# EAGLE schematic Encoder PCB - REV 17.2 (EAGLE 7.5.0)

## Sheet 1 of 11
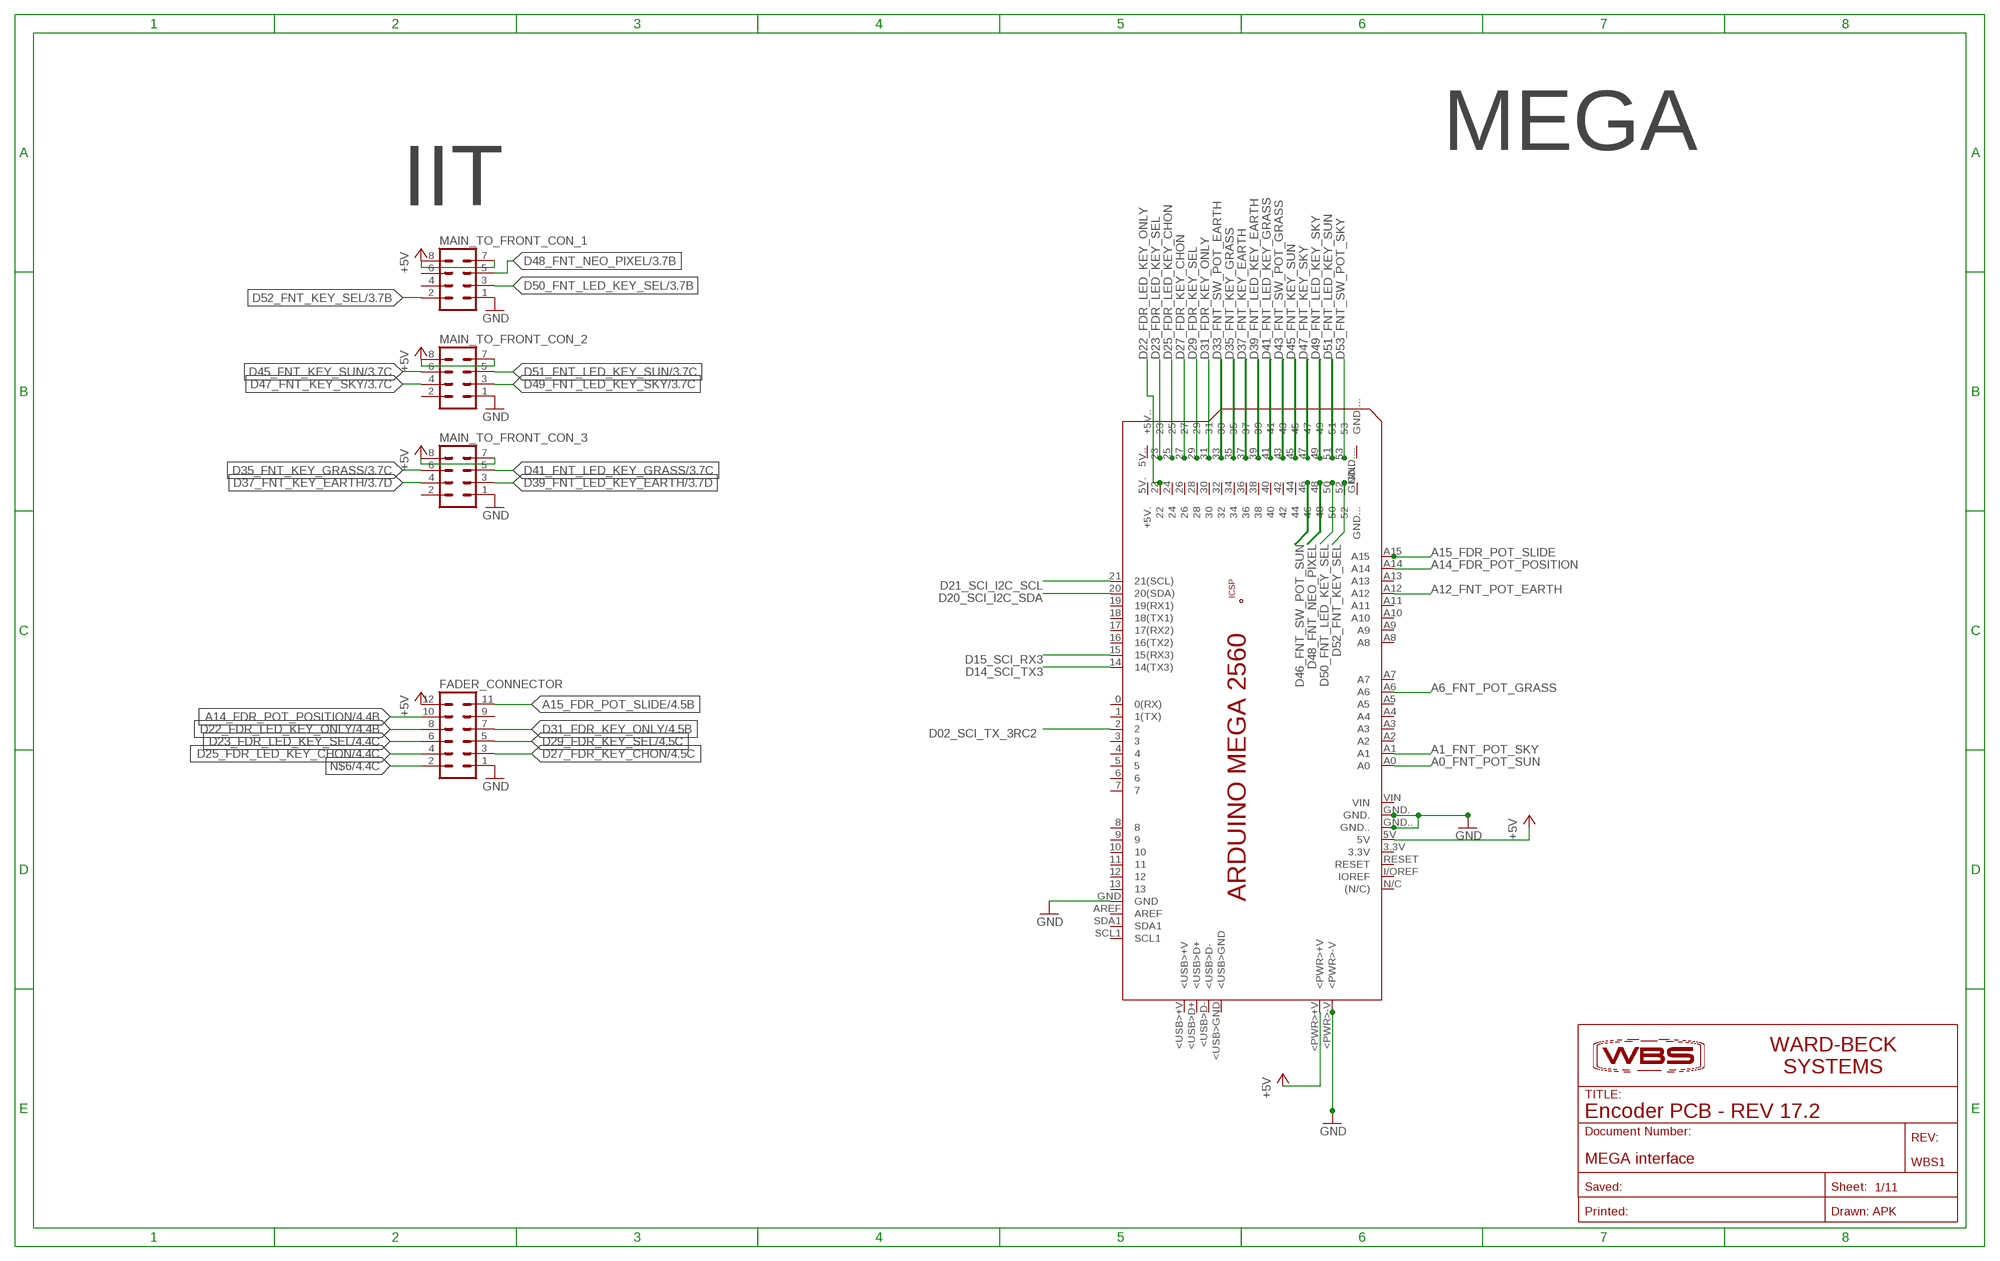
[diagram p0: schematic, sheet 1]

### Parts
FADER_CONNECTOR  MA06-2  [MA06-2]
MAIN_TO_FRONT_CON_1  MA04-2  [MA04-2]
MAIN_TO_FRONT_CON_2  MA04-2  [MA04-2]
MAIN_TO_FRONT_CON_3  MA04-2  [MA04-2]
PCB1  ARDUINO_MEGA2560  [ARDUINO_MEGA2560]
WBS1  MEGA interface  WBS-DOCUMENT_INFO_FRAME  [WBS-FRAME_PCB]

### Nets
+5V: FADER_CONNECTOR.12 MAIN_TO_FRONT_CON_1.7 MAIN_TO_FRONT_CON_1.8 MAIN_TO_FRONT_CON_2.7 MAIN_TO_FRONT_CON_2.8 MAIN_TO_FRONT_CON_3.7 MAIN_TO_FRONT_CON_3.8 PCB1.5V PCB1.<PWR>+V ; also sheet 2,3,4,5,6
A0_FNT_POT_SUN: PCB1.A0 ; also sheet 2
A1_FNT_POT_SKY: PCB1.A1 ; also sheet 2
A6_FNT_POT_GRASS: PCB1.A6 ; also sheet 2
A12_FNT_POT_EARTH: PCB1.A12 ; also sheet 2
A14_FDR_POT_POSITION: FADER_CONNECTOR.10 PCB1.A14 ; also sheet 4
A15_FDR_POT_SLIDE: FADER_CONNECTOR.11 PCB1.A15 ; also sheet 4
D02_SCI_TX_3RC2: PCB1.2 ; also sheet 5
D14_SCI_TX3: PCB1.14(14(TX3)) ; also sheet 5
D15_SCI_RX3: PCB1.15(15(RX3)) ; also sheet 5
D20_SCI_I2C_SDA: PCB1.20(20(SDA)) ; also sheet 6
D21_SCI_I2C_SCL: PCB1.21(21(SCL)) ; also sheet 6
D22_FDR_LED_KEY_ONLY: FADER_CONNECTOR.8 PCB1.22 ; also sheet 4
D23_FDR_LED_KEY_SEL: FADER_CONNECTOR.6 PCB1.23 ; also sheet 4
D25_FDR_LED_KEY_CHON: FADER_CONNECTOR.4 PCB1.25 ; also sheet 4
D27_FDR_KEY_CHON: FADER_CONNECTOR.3 PCB1.27 ; also sheet 4
D29_FDR_KEY_SEL: FADER_CONNECTOR.5 PCB1.29 ; also sheet 4
D31_FDR_KEY_ONLY: FADER_CONNECTOR.7 PCB1.31 ; also sheet 4
D33_FNT_SW_POT_EARTH: PCB1.33 ; also sheet 2
D35_FNT_KEY_GRASS: MAIN_TO_FRONT_CON_3.6 PCB1.35 ; also sheet 3
D37_FNT_KEY_EARTH: MAIN_TO_FRONT_CON_3.4 PCB1.37 ; also sheet 3
D39_FNT_LED_KEY_EARTH: MAIN_TO_FRONT_CON_3.3 PCB1.39 ; also sheet 3
D41_FNT_LED_KEY_GRASS: MAIN_TO_FRONT_CON_3.5 PCB1.41 ; also sheet 3
D43_FNT_SW_POT_GRASS: PCB1.43 ; also sheet 2
D45_FNT_KEY_SUN: MAIN_TO_FRONT_CON_2.6 PCB1.45 ; also sheet 3
D46_FNT_SW_POT_SUN: PCB1.46 ; also sheet 2
D47_FNT_KEY_SKY: MAIN_TO_FRONT_CON_2.4 PCB1.47 ; also sheet 3
D48_FNT_NEO_PIXEL: MAIN_TO_FRONT_CON_1.5 PCB1.48 ; also sheet 3
D49_FNT_LED_KEY_SKY: MAIN_TO_FRONT_CON_2.3 PCB1.49 ; also sheet 3
D50_FNT_LED_KEY_SEL: MAIN_TO_FRONT_CON_1.3 PCB1.50 ; also sheet 3
D51_FNT_LED_KEY_SUN: MAIN_TO_FRONT_CON_2.5 PCB1.51 ; also sheet 3
D52_FNT_KEY_SEL: MAIN_TO_FRONT_CON_1.2 PCB1.52 ; also sheet 3
D53_FNT_SW_POT_SKY: PCB1.53 ; also sheet 2
GND: FADER_CONNECTOR.1 MAIN_TO_FRONT_CON_1.1 MAIN_TO_FRONT_CON_2.1 MAIN_TO_FRONT_CON_3.1 PCB1.<PWR>-V PCB1.GND PCB1.GND. PCB1.GND.. ; also sheet 2,3,4,5,6,7,11
N$6: FADER_CONNECTOR.2 ; also sheet 4
Unconnected: FADER_CONNECTOR.9 MAIN_TO_FRONT_CON_1.4 MAIN_TO_FRONT_CON_1.6 MAIN_TO_FRONT_CON_2.2 MAIN_TO_FRONT_CON_3.2 PCB1.0(0(RX)) PCB1.1(1(TX)) PCB1.3 PCB1.3.3V PCB1.4 PCB1.5 PCB1.5V.(+5V.) PCB1.5V..(+5V..) PCB1.6 PCB1.7 PCB1.8 PCB1.9 PCB1.10 PCB1.11 PCB1.12 PCB1.13 PCB1.16(16(TX2)) PCB1.17(17(RX2)) PCB1.18(18(TX1)) PCB1.19(19(RX1)) PCB1.24 PCB1.26 PCB1.28 PCB1.30 PCB1.32 PCB1.34 PCB1.36 PCB1.38 PCB1.40 PCB1.42 PCB1.44 PCB1.+5V_ PCB1.<USB>+V PCB1.<USB>D+ PCB1.<USB>D- PCB1.<USB>GND PCB1.A2 PCB1.A3 PCB1.A4 PCB1.A5 PCB1.A7 PCB1.A8 PCB1.A9 PCB1.A10 PCB1.A11 PCB1.A13 PCB1.AREF PCB1.GND... PCB1.GND.... PCB1.GND__ PCB1.I/OREF(IOREF) PCB1.MISO PCB1.MOSI PCB1.N/C((N/C)) PCB1.RESET PCB1.RESET. PCB1.SCK PCB1.SCL1 PCB1.SDA1 PCB1.VIN

### Notes on the sheet
- MEGA
- IIT

## Sheet 2 of 11
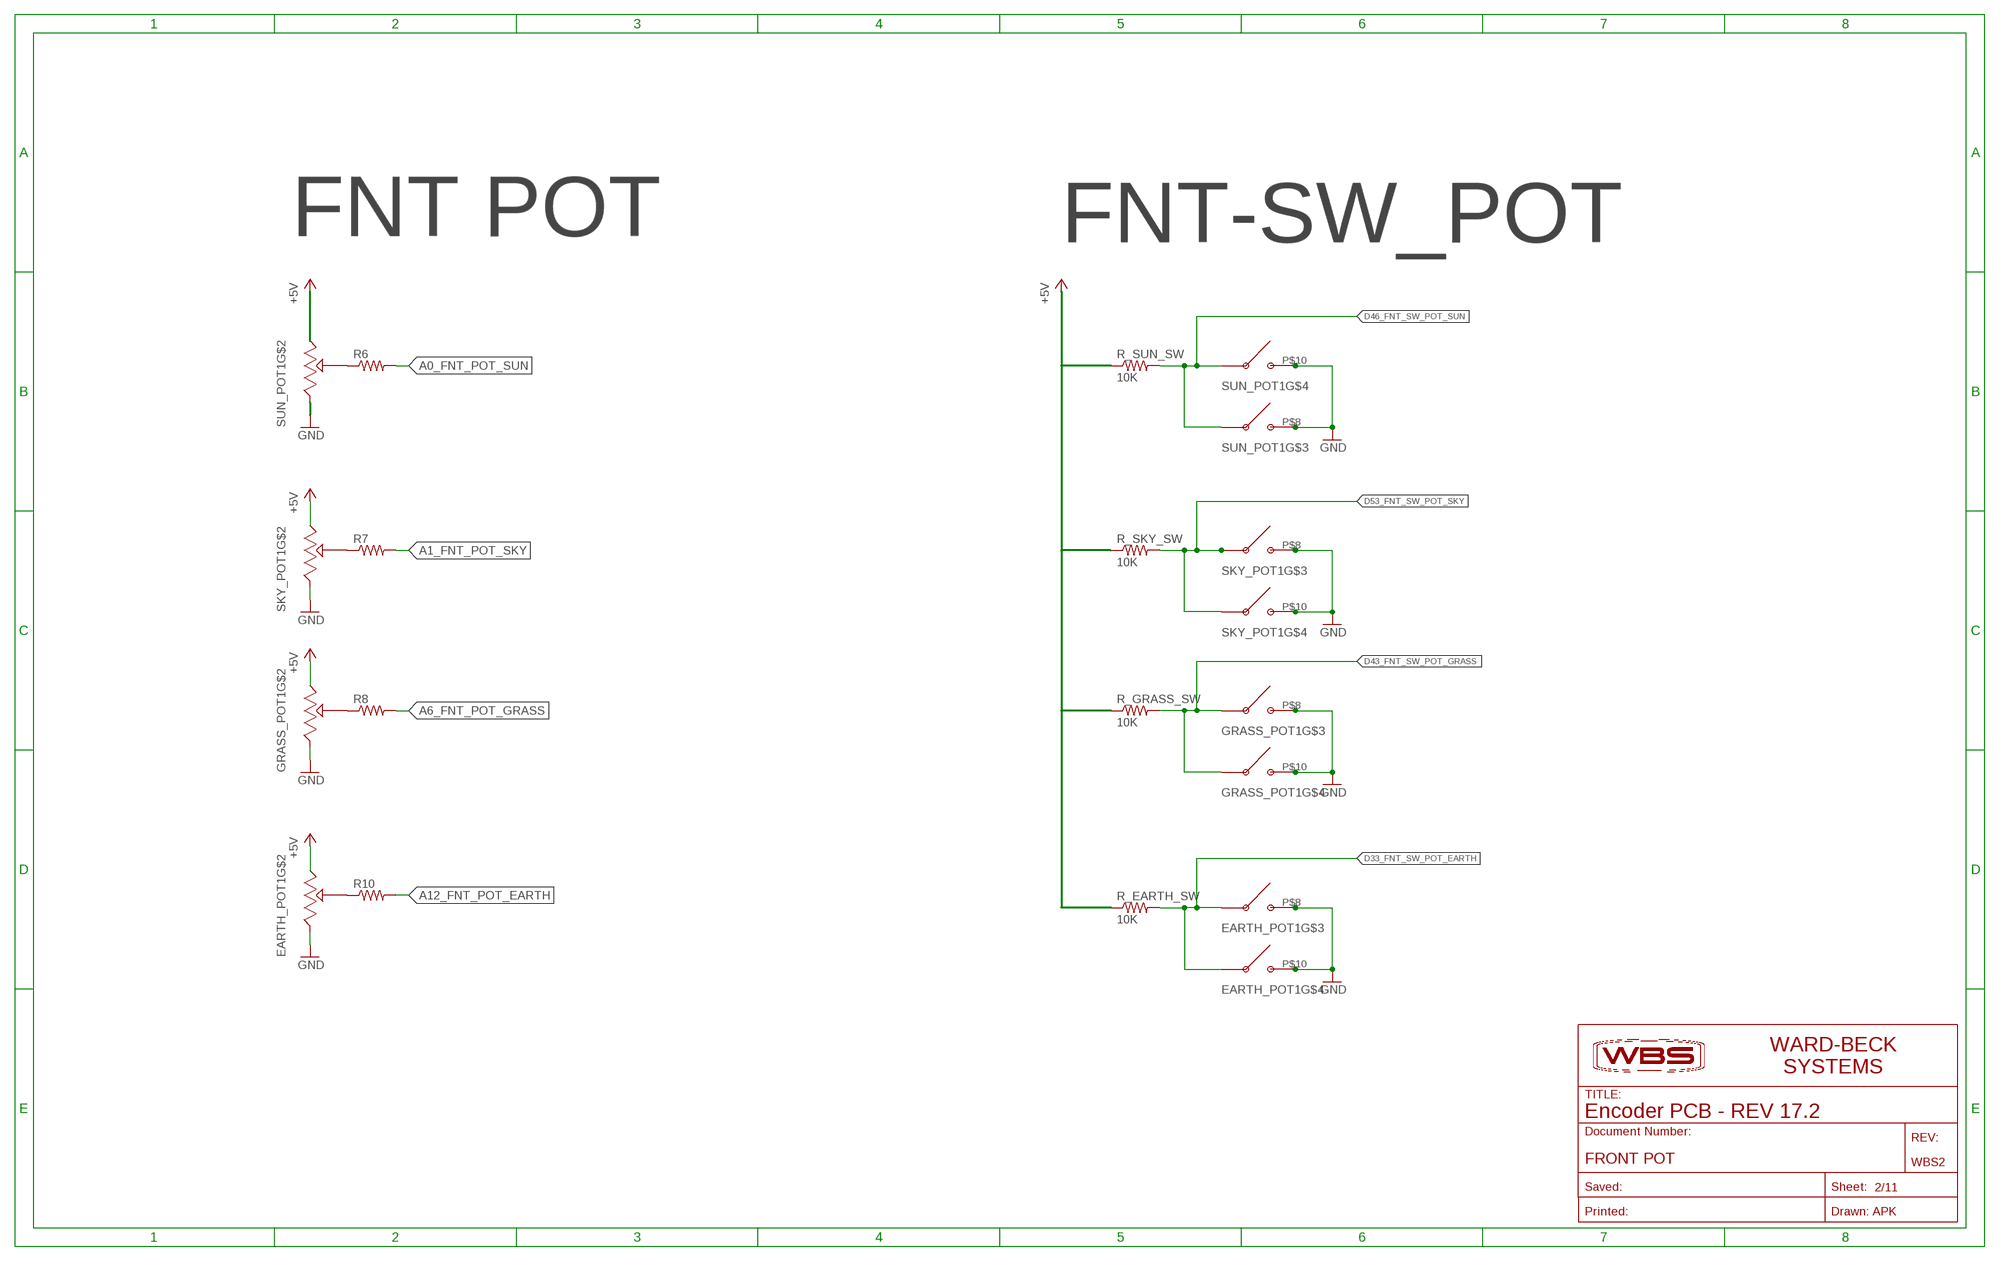
[diagram p1: schematic, sheet 2]

### Parts
EARTH_POT1  WBS_10-081_DUALPOT+DUALSWITCH  [WBS_10-081]
GRASS_POT1  WBS_10-081_DUALPOT+DUALSWITCH  [WBS_10-081]
R6  R-US_0309/12  [0309/12]
R7  R-US_0309/12  [0309/12]
R8  R-US_0309/12  [0309/12]
R10  R-US_0309/12  [0309/12]
R_EARTH_SW  10K  R-US_M0805  [M0805]
R_GRASS_SW  10K  R-US_M0805  [M0805]
R_SKY_SW  10K  R-US_M0805  [M0805]
R_SUN_SW  10K  R-US_M0805  [M0805]
SKY_POT1  WBS_10-081_DUALPOT+DUALSWITCH  [WBS_10-081]
SUN_POT1  WBS_10-081_DUALPOT+DUALSWITCH  [WBS_10-081]
WBS2  FRONT POT  WBS-DOCUMENT_INFO_FRAME  [WBS-FRAME_PCB]

### Nets
+5V: EARTH_POT1.P$6(CW) GRASS_POT1.P$6(CW) R_EARTH_SW.1 R_GRASS_SW.1 R_SKY_SW.1 R_SUN_SW.1 SKY_POT1.P$6(CW) SUN_POT1.P$6(CW) ; also sheet 1,3,4,5,6
A0_FNT_POT_SUN: R6.2 ; also sheet 1
A1_FNT_POT_SKY: R7.2 ; also sheet 1
A6_FNT_POT_GRASS: R8.2 ; also sheet 1
A12_FNT_POT_EARTH: R10.2 ; also sheet 1
D33_FNT_SW_POT_EARTH: EARTH_POT1.P$7 EARTH_POT1.P$9 R_EARTH_SW.2 ; also sheet 1
D43_FNT_SW_POT_GRASS: GRASS_POT1.P$7 GRASS_POT1.P$9 R_GRASS_SW.2 ; also sheet 1
D46_FNT_SW_POT_SUN: R_SUN_SW.2 SUN_POT1.P$7 SUN_POT1.P$9 ; also sheet 1
D53_FNT_SW_POT_SKY: R_SKY_SW.2 SKY_POT1.P$7 SKY_POT1.P$9 ; also sheet 1
GND: EARTH_POT1.P$4(CCW) EARTH_POT1.P$8 EARTH_POT1.P$10 GRASS_POT1.P$4(CCW) GRASS_POT1.P$8 GRASS_POT1.P$10 SKY_POT1.P$4(CCW) SKY_POT1.P$8 SKY_POT1.P$10 SUN_POT1.P$4(CCW) SUN_POT1.P$8 SUN_POT1.P$10 ; also sheet 1,3,4,5,6,7,11
N$8: EARTH_POT1.P$5(WIPER) R10.1
N$9: R7.1 SKY_POT1.P$5(WIPER)
N$11: R6.1 SUN_POT1.P$5(WIPER)
N$13: GRASS_POT1.P$5(WIPER) R8.1
Unconnected: EARTH_POT1.P$1(CCW) EARTH_POT1.P$2(WIPER) EARTH_POT1.P$3(CW) GRASS_POT1.P$1(CCW) GRASS_POT1.P$2(WIPER) GRASS_POT1.P$3(CW) SKY_POT1.P$1(CCW) SKY_POT1.P$2(WIPER) SKY_POT1.P$3(CW) SUN_POT1.P$1(CCW) SUN_POT1.P$2(WIPER) SUN_POT1.P$3(CW)

### Notes on the sheet
- FNT POT | FNT-SW_POT

## Sheet 3 of 11
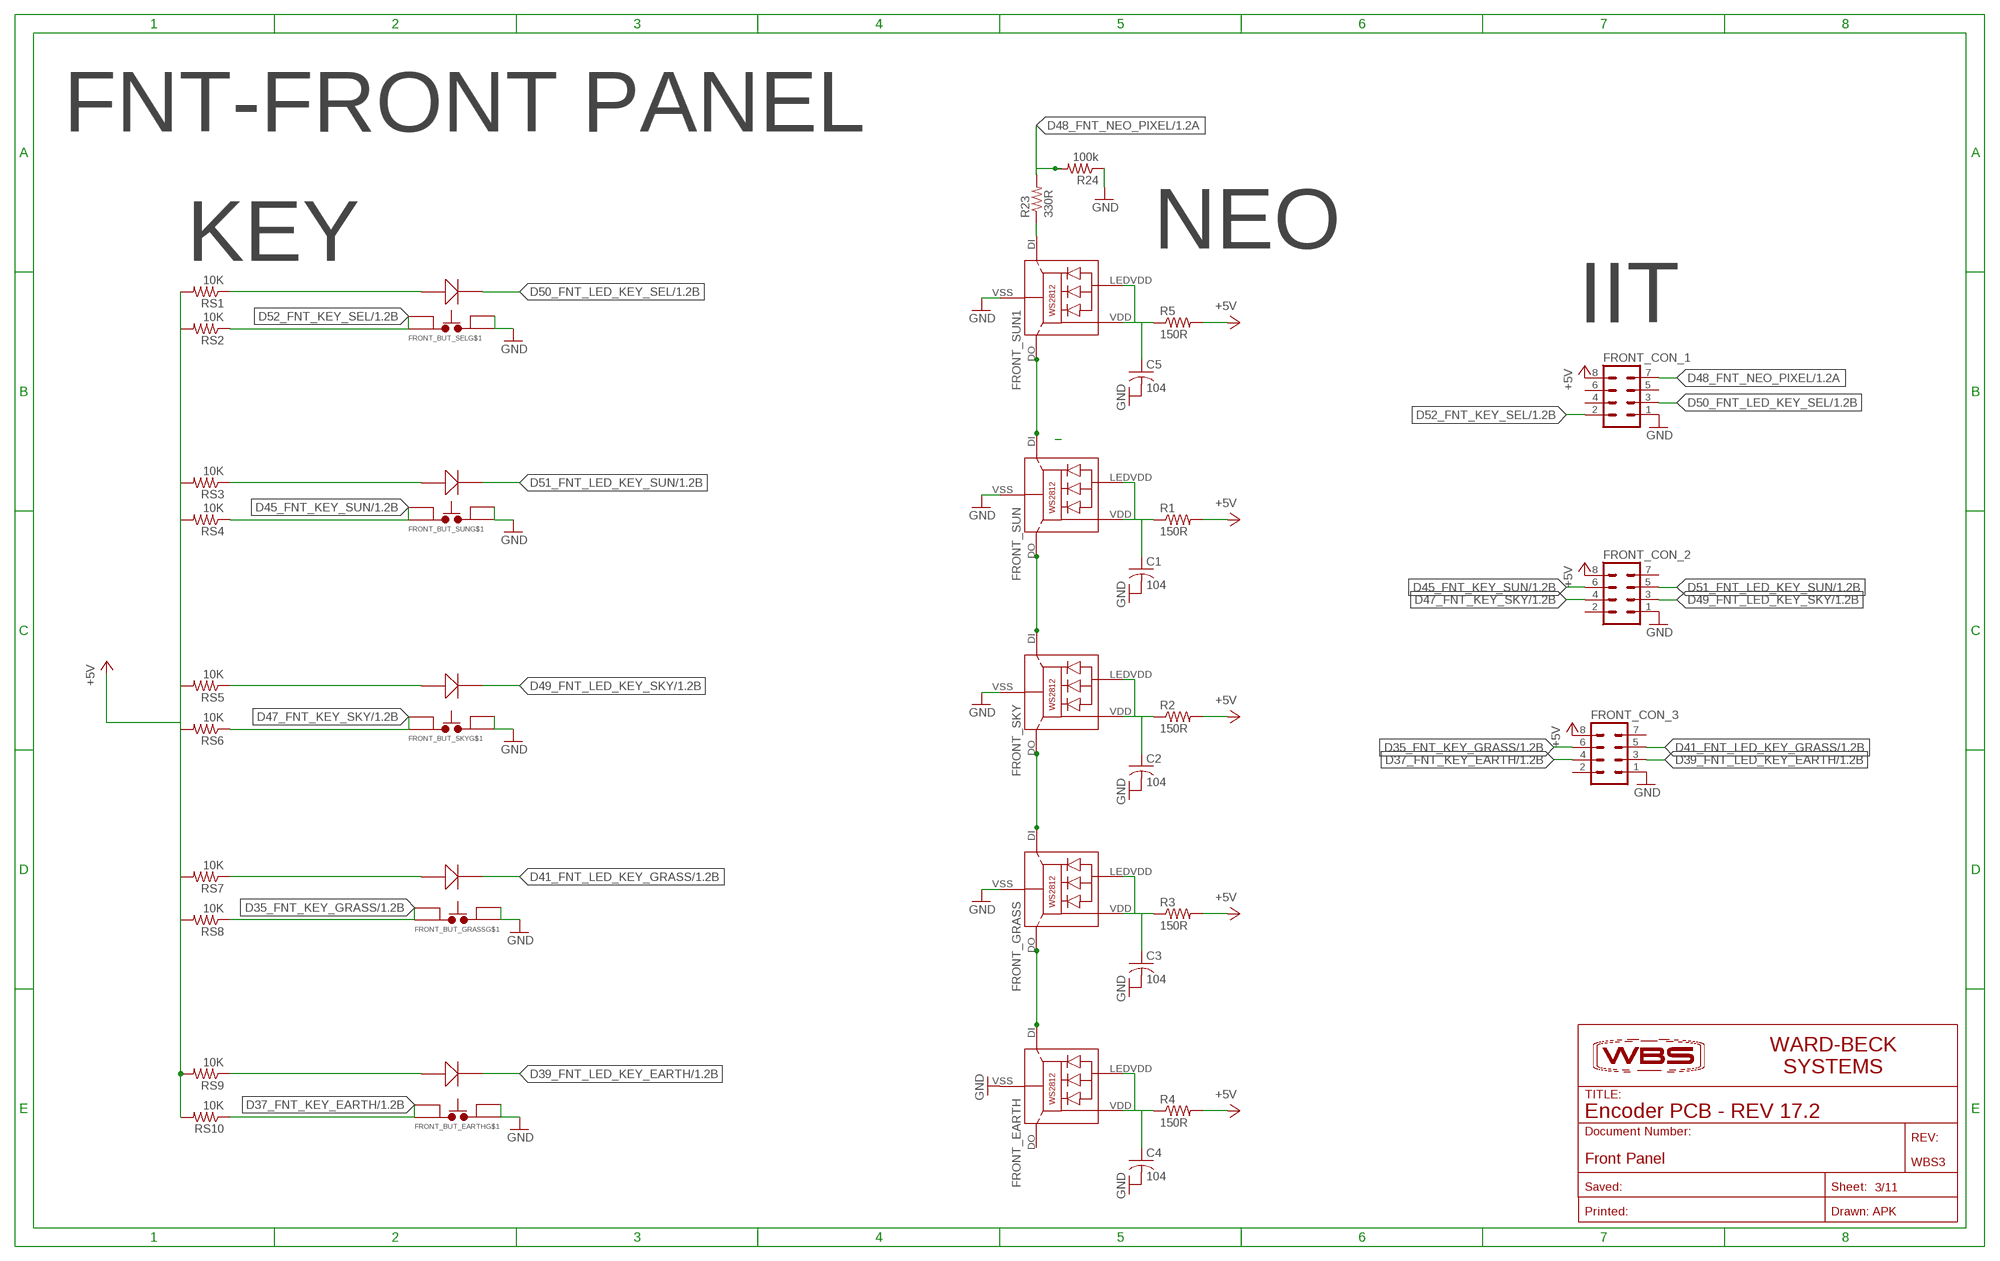
[diagram p2: schematic, sheet 3]

### Parts
C1  104  C-USC0805  [C0805]
C2  104  C-USC0805  [C0805]
C3  104  C-USC0805  [C0805]
C4  104  C-USC0805  [C0805]
C5  104  C-USC0805  [C0805]
FRONT_BUT_EARTH  SWITCH-POD-BUTTON_WITH_LED  [SWITCH-PODBUTTON]
FRONT_BUT_GRASS  SWITCH-POD-BUTTON_WITH_LED  [SWITCH-PODBUTTON]
FRONT_BUT_SEL  SWITCH-POD-BUTTON_WITH_LED  [SWITCH-PODBUTTON]
FRONT_BUT_SKY  SWITCH-POD-BUTTON_WITH_LED  [SWITCH-PODBUTTON]
FRONT_BUT_SUN  SWITCH-POD-BUTTON_WITH_LED  [SWITCH-PODBUTTON]
FRONT_CON_1  MA04-2  [MA04-2]
FRONT_CON_2  MA04-2  [MA04-2]
FRONT_CON_3  MA04-2  [MA04-2]
FRONT_EARTH  WS2812  [WS2812]
FRONT_GRASS  WS2812  [WS2812]
FRONT_SKY  WS2812  [WS2812]
FRONT_SUN  WS2812  [WS2812]
FRONT_SUN1  WS2812  [WS2812]
R1  150R  R-US_M0805  [M0805]
R2  150R  R-US_M0805  [M0805]
R3  150R  R-US_M0805  [M0805]
R4  150R  R-US_M0805  [M0805]
R5  150R  R-US_M0805  [M0805]
R23  330R  R-US_M0805  [M0805]
R24  100k  R-US_M0805  [M0805]
RS1  10K  R-US_M0805  [M0805]
RS2  10K  R-US_M0805  [M0805]
RS3  10K  R-US_M0805  [M0805]
RS4  10K  R-US_M0805  [M0805]
RS5  10K  R-US_M0805  [M0805]
RS6  10K  R-US_M0805  [M0805]
RS7  10K  R-US_M0805  [M0805]
RS8  10K  R-US_M0805  [M0805]
RS9  10K  R-US_M0805  [M0805]
RS10  10K  R-US_M0805  [M0805]
WBS3  Front Panel  WBS-DOCUMENT_INFO_FRAME  [WBS-FRAME_PCB]

### Nets
+5V: FRONT_CON_1.8 FRONT_CON_2.8 FRONT_CON_3.8 R1.2 R2.2 R3.2 R4.2 R5.2 RS1.2 RS2.2 RS3.2 RS4.2 RS5.2 RS6.2 RS7.2 RS8.2 RS9.2 RS10.2 ; also sheet 1,2,4,5,6
D35_FNT_KEY_GRASS: FRONT_BUT_GRASS.SW1A FRONT_BUT_GRASS.SW2A FRONT_CON_3.6 RS8.1 ; also sheet 1
D37_FNT_KEY_EARTH: FRONT_BUT_EARTH.SW1A FRONT_BUT_EARTH.SW2A FRONT_CON_3.4 RS10.1 ; also sheet 1
D39_FNT_LED_KEY_EARTH: FRONT_BUT_EARTH.LEDB FRONT_CON_3.3 ; also sheet 1
D41_FNT_LED_KEY_GRASS: FRONT_BUT_GRASS.LEDB FRONT_CON_3.5 ; also sheet 1
D45_FNT_KEY_SUN: FRONT_BUT_SUN.SW1A FRONT_BUT_SUN.SW2A FRONT_CON_2.6 RS4.1 ; also sheet 1
D47_FNT_KEY_SKY: FRONT_BUT_SKY.SW1A FRONT_BUT_SKY.SW2A FRONT_CON_2.4 RS6.1 ; also sheet 1
D48_FNT_NEO_PIXEL: FRONT_CON_1.7 R23.2 R24.2 ; also sheet 1
D49_FNT_LED_KEY_SKY: FRONT_BUT_SKY.LEDB FRONT_CON_2.3 ; also sheet 1
D50_FNT_LED_KEY_SEL: FRONT_BUT_SEL.LEDB FRONT_CON_1.3 ; also sheet 1
D51_FNT_LED_KEY_SUN: FRONT_BUT_SUN.LEDB FRONT_CON_2.5 ; also sheet 1
D52_FNT_KEY_SEL: FRONT_BUT_SEL.SW1A FRONT_BUT_SEL.SW2A FRONT_CON_1.2 RS2.1 ; also sheet 1
GND: C1.2 C2.2 C3.2 C4.2 C5.2 FRONT_BUT_EARTH.SW1B FRONT_BUT_EARTH.SW2B FRONT_BUT_GRASS.SW1B FRONT_BUT_GRASS.SW2B FRONT_BUT_SEL.SW1B FRONT_BUT_SEL.SW2B FRONT_BUT_SKY.SW1B FRONT_BUT_SKY.SW2B FRONT_BUT_SUN.SW1B FRONT_BUT_SUN.SW2B FRONT_CON_1.1 FRONT_CON_2.1 FRONT_CON_3.1 FRONT_EARTH.VSS(GND) FRONT_GRASS.VSS(GND) FRONT_SKY.VSS(GND) FRONT_SUN1.VSS(GND) FRONT_SUN.VSS(GND) R24.1 ; also sheet 1,2,4,5,6,7,11
N$2: FRONT_BUT_GRASS.LEDA RS7.1
N$5: FRONT_BUT_SKY.LEDA RS5.1
N$7: C1.1 FRONT_SUN.LEDVDD FRONT_SUN.VDD R1.1
N$10: FRONT_BUT_SUN.LEDA RS3.1
N$12: FRONT_BUT_SEL.LEDA RS1.1
N$14: FRONT_GRASS.DI FRONT_SKY.DO
N$16: C2.1 FRONT_SKY.LEDVDD FRONT_SKY.VDD R2.1
N$17: FRONT_BUT_EARTH.LEDA RS9.1
N$20: C3.1 FRONT_GRASS.LEDVDD FRONT_GRASS.VDD R3.1
N$22: FRONT_SUN1.DO FRONT_SUN.DI
N$23: C4.1 FRONT_EARTH.LEDVDD FRONT_EARTH.VDD R4.1
N$25: C5.1 FRONT_SUN1.LEDVDD FRONT_SUN1.VDD R5.1
N$26: FRONT_EARTH.DI FRONT_GRASS.DO FRONT_SKY.DI FRONT_SUN.DO
N$40: FRONT_SUN1.DI R23.1
Unconnected: FRONT_CON_1.4 FRONT_CON_1.5 FRONT_CON_1.6 FRONT_CON_2.2 FRONT_CON_2.7 FRONT_CON_3.2 FRONT_CON_3.7 FRONT_EARTH.DO

### Notes on the sheet
- FNT-FRONT PANEL
- KEY | NEO
- IIT

## Sheet 4 of 11
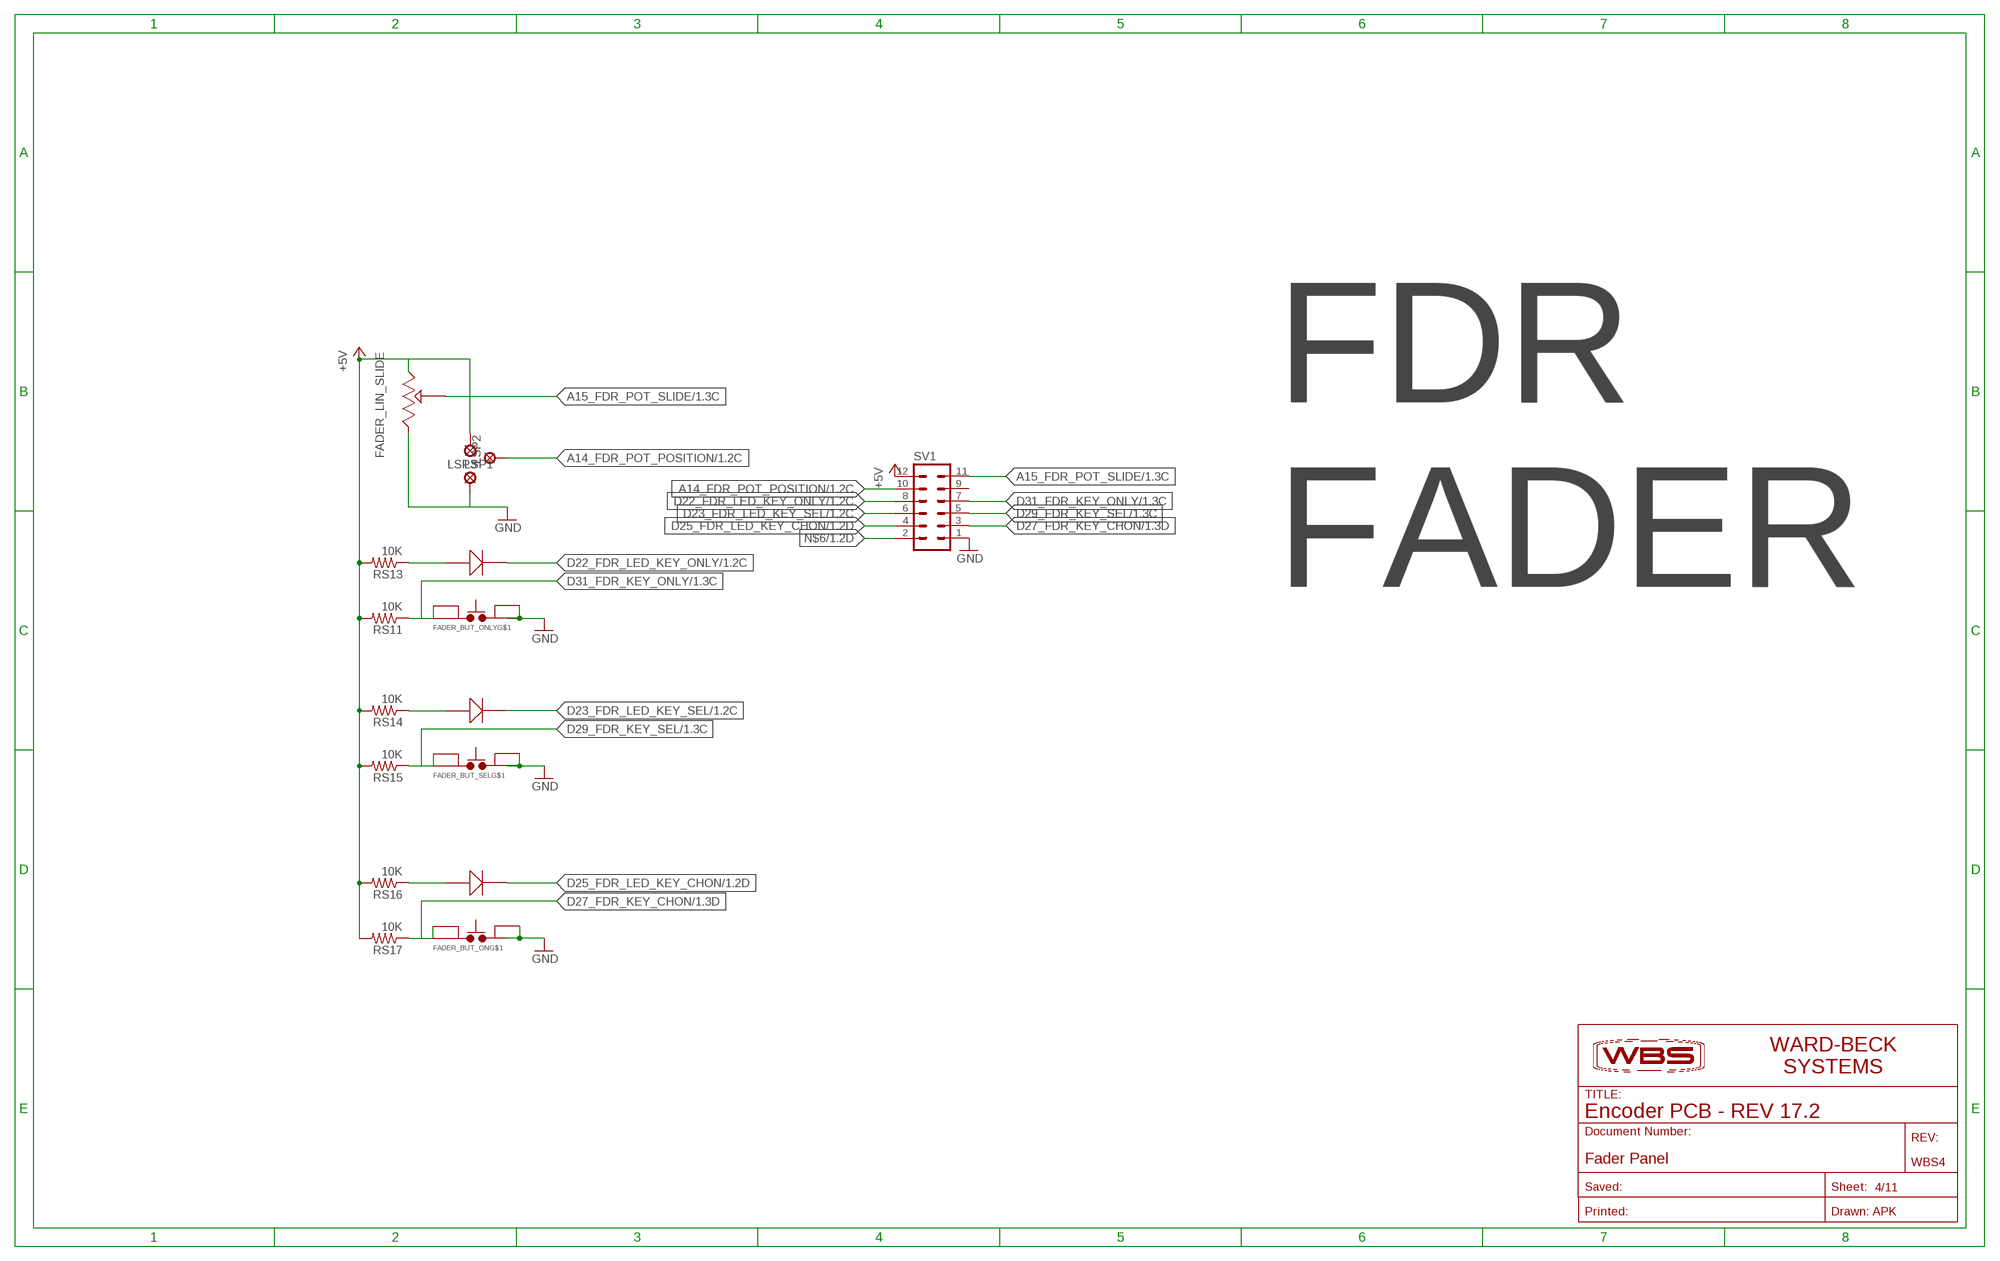
[diagram p3: schematic, sheet 4]

### Parts
FADER_BUT_ON  SWITCH-POD-BUTTON_WITH_LED  [SWITCH-PODBUTTON]
FADER_BUT_ONLY  SWITCH-POD-BUTTON_WITH_LED  [SWITCH-PODBUTTON]
FADER_BUT_SEL  SWITCH-POD-BUTTON_WITH_LED  [SWITCH-PODBUTTON]
FADER_LIN_SLIDE  BOURNS-PTA6043_SLIDEPOT  [BOURNS-PTA6043_SLIDEPOT]
LSP1  MCS10B  [MCS10B]
LSP2  MCS10B  [MCS10B]
LSP3  MCS10B  [MCS10B]
RS11  10K  R-US_M0805  [M0805]
RS13  10K  R-US_M0805  [M0805]
RS14  10K  R-US_M0805  [M0805]
RS15  10K  R-US_M0805  [M0805]
RS16  10K  R-US_M0805  [M0805]
RS17  10K  R-US_M0805  [M0805]
SV1  MA06-2  [MA06-2]
WBS4  Fader Panel  WBS-DOCUMENT_INFO_FRAME  [WBS-FRAME_PCB]

### Nets
+5V: FADER_LIN_SLIDE.P$3(CW) LSP3.MP RS11.2 RS13.2 RS14.2 RS15.2 RS16.2 RS17.2 SV1.12 ; also sheet 1,2,3,5,6
A14_FDR_POT_POSITION: LSP2.MP SV1.10 ; also sheet 1
A15_FDR_POT_SLIDE: FADER_LIN_SLIDE.P$2(WIPER) SV1.11 ; also sheet 1
D22_FDR_LED_KEY_ONLY: FADER_BUT_ONLY.LEDB SV1.8 ; also sheet 1
D23_FDR_LED_KEY_SEL: FADER_BUT_SEL.LEDB SV1.6 ; also sheet 1
D25_FDR_LED_KEY_CHON: FADER_BUT_ON.LEDB SV1.4 ; also sheet 1
D27_FDR_KEY_CHON: FADER_BUT_ON.SW1A FADER_BUT_ON.SW2A RS17.1 SV1.3 ; also sheet 1
D29_FDR_KEY_SEL: FADER_BUT_SEL.SW1A FADER_BUT_SEL.SW2A RS15.1 SV1.5 ; also sheet 1
D31_FDR_KEY_ONLY: FADER_BUT_ONLY.SW1A FADER_BUT_ONLY.SW2A RS11.1 SV1.7 ; also sheet 1
GND: FADER_BUT_ON.SW1B FADER_BUT_ON.SW2B FADER_BUT_ONLY.SW1B FADER_BUT_ONLY.SW2B FADER_BUT_SEL.SW1B FADER_BUT_SEL.SW2B FADER_LIN_SLIDE.P$1(CCW) LSP1.MP SV1.1 ; also sheet 1,2,3,5,6,7,11
N$1: FADER_BUT_ON.LEDA RS16.1
N$3: FADER_BUT_SEL.LEDA RS14.1
N$4: FADER_BUT_ONLY.LEDA RS13.1
N$6: SV1.2 ; also sheet 1
Unconnected: SV1.9

### Notes on the sheet
- FDR
  FADER

## Sheet 5 of 11
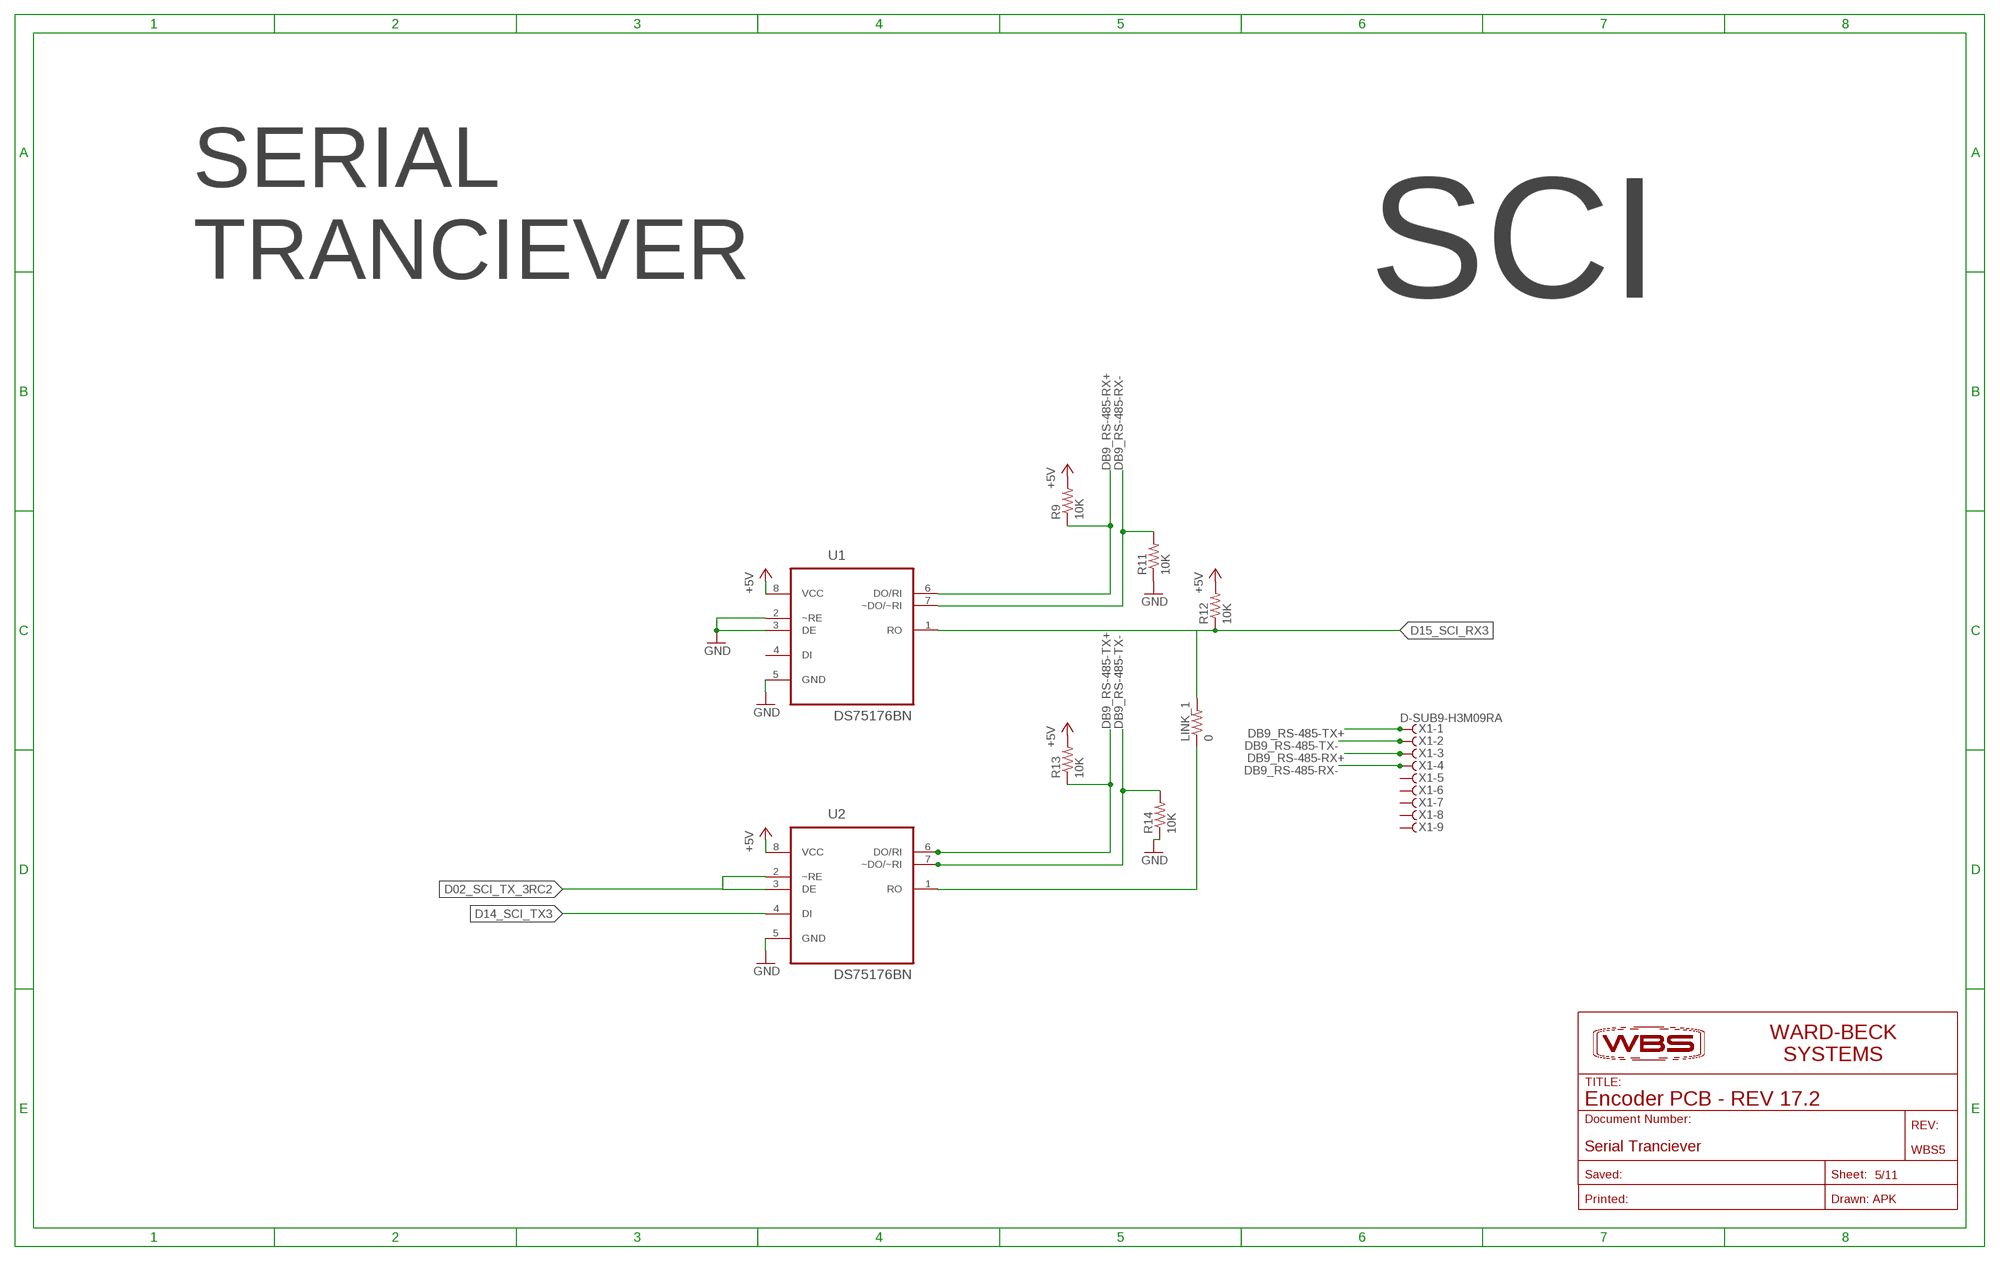
[diagram p4: schematic, sheet 5]

### Parts
LINK_1  0  R-US_M0805  [M0805]
R9  10K  R-US_M0805  [M0805]
R11  10K  R-US_M0805  [M0805]
R12  10K  R-US_M0805  [M0805]
R13  10K  R-US_M0805  [M0805]
R14  10K  R-US_M0805  [M0805]
U1  DS75176BN  [DIP254P762X508-8]
U2  DS75176BN  [DIP254P762X508-8]
WBS5  Serial Tranciever  WBS-DOCUMENT_INFO_FRAME  [WBS-FRAME_PCB]
X1  D-SUB9-H3M09RA  [H3M09RA]

### Nets
+5V: R9.2 R12.2 R13.2 U1.8(VCC) U2.8(VCC) ; also sheet 1,2,3,4,6
D02_SCI_TX_3RC2: U2.2(~RE) U2.3(DE) ; also sheet 1
D14_SCI_TX3: U2.4(DI) ; also sheet 1
D15_SCI_RX3: LINK_1.2 R12.1 U1.1(RO) ; also sheet 1
DB9_RS-485-RX+: R9.1 U1.6(DO/RI) X1.3
DB9_RS-485-RX-: R11.2 U1.7(~DO/~RI) X1.4
DB9_RS-485-TX+: R13.1 U2.6(DO/RI) X1.1
DB9_RS-485-TX-: R14.2 U2.7(~DO/~RI) X1.2
GND: R11.1 R14.1 U1.2(~RE) U1.3(DE) U1.5(GND) U2.5(GND) ; also sheet 1,2,3,4,6,7,11
N$15: LINK_1.1 U2.1(RO)
Unconnected: U1.4(DI) X1.5 X1.6 X1.7 X1.8 X1.9

### Notes on the sheet
- SERIAL
  TRANCIEVER
- SCI

## Sheet 6 of 11
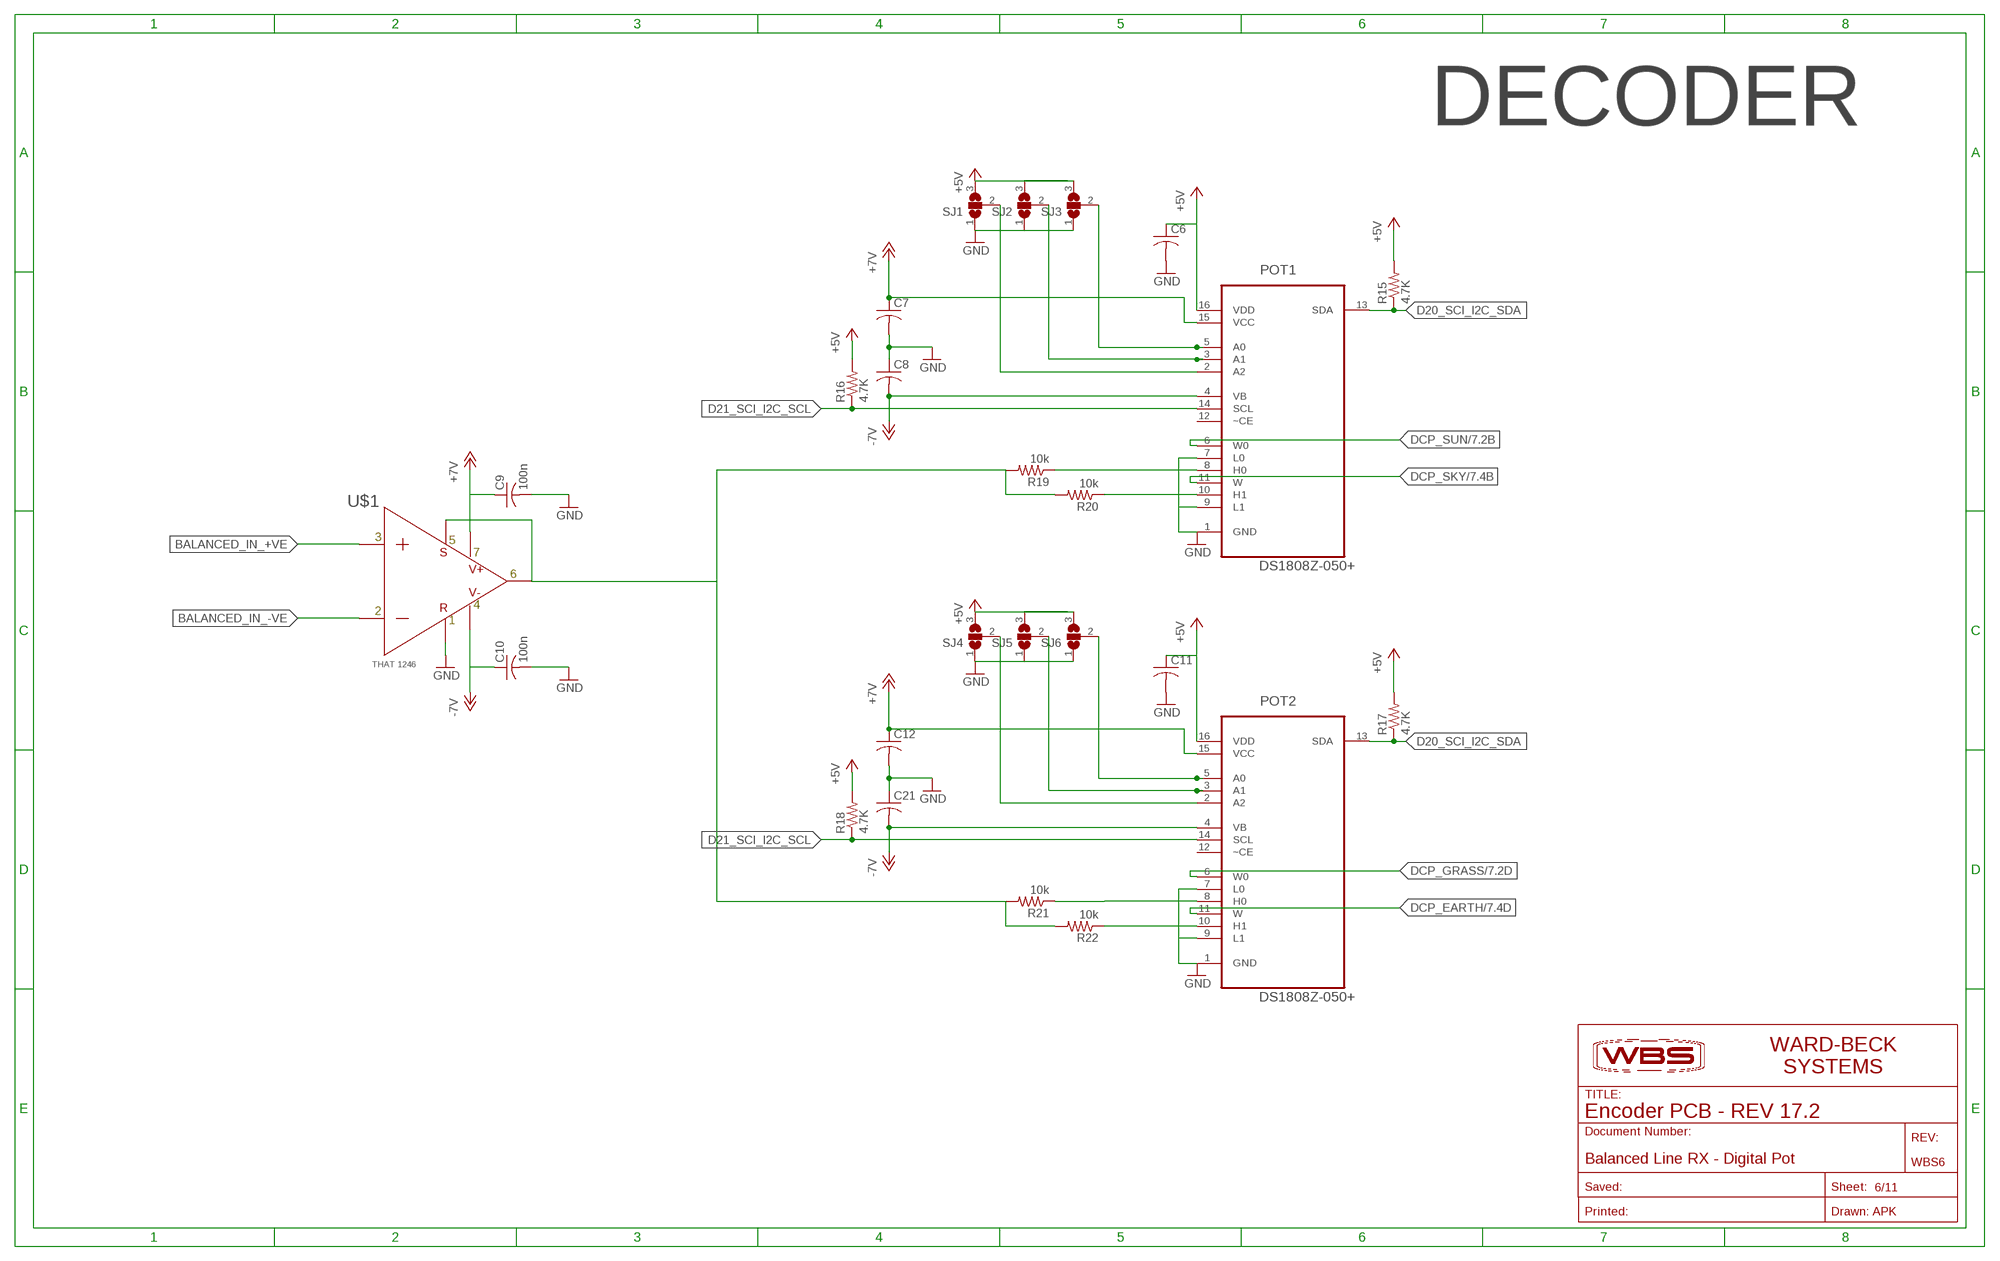
[diagram p5: schematic, sheet 6]

### Parts
C6  C-USC0805  [C0805]
C7  C-USC0805  [C0805]
C8  C-USC0805  [C0805]
C9  100n  C-USC0805  [C0805]
C10  100n  C-USC0805  [C0805]
C11  C-USC0805  [C0805]
C12  C-USC0805  [C0805]
C21  C-USC0805  [C0805]
POT1  DS1808Z-050+  [SOIC127P600X175-16N]
POT2  DS1808Z-050+  [SOIC127P600X175-16N]
R15  4.7K  R-US_M0805  [M0805]
R16  4.7K  R-US_M0805  [M0805]
R17  4.7K  R-US_M0805  [M0805]
R18  4.7K  R-US_M0805  [M0805]
R19  10k  R-US_M0805  [M0805]
R20  10k  R-US_M0805  [M0805]
R21  10k  R-US_M0805  [M0805]
R22  10k  R-US_M0805  [M0805]
SJ1  SJ2W  [SJ_2]
SJ2  SJ2W  [SJ_2]
SJ3  SJ2W  [SJ_2]
SJ4  SJ2W  [SJ_2]
SJ5  SJ2W  [SJ_2]
SJ6  SJ2W  [SJ_2]
U$1  OPAMP-THAT1246_LINE_RECEIVER  [DIP8]
WBS6  Balanced Line RX - Digital Pot  WBS-DOCUMENT_INFO_FRAME  [WBS-FRAME_PCB]

### Nets
+5V: C6.1 C11.1 POT1.16(VDD) POT2.16(VDD) R15.2 R16.2 R17.2 R18.2 SJ1.3 SJ2.3 SJ3.3 SJ4.3 SJ5.3 SJ6.3 ; also sheet 1,2,3,4,5
+12V: C7.1 C9.1 C12.1 POT1.15(VCC) POT2.15(VCC) U$1.P$7(V+) ; supply symbol labelled +7V ; also sheet 7
-12V: C8.2 C10.1 C21.2 POT1.4(VB) POT2.4(VB) U$1.P$4(V-) ; supply symbol labelled -7V ; also sheet 7
BALANCED_IN_+VE: U$1.P$3(IN+)
BALANCED_IN_-VE: U$1.P$2(IN-)
D20_SCI_I2C_SDA: POT1.13(SDA) POT2.13(SDA) R15.1 R17.1 ; also sheet 1
D21_SCI_I2C_SCL: POT1.14(SCL) POT2.14(SCL) R16.1 R18.1 ; also sheet 1
DCP_EARTH: POT2.11(W) ; also sheet 7
DCP_GRASS: POT2.6(W0) ; also sheet 7
DCP_SKY: POT1.11(W) ; also sheet 7
DCP_SUN: POT1.6(W0) ; also sheet 7
GND: C6.2 C9.2 C10.2 C11.2 POT1.1(GND) POT1.7(L0) POT1.9(L1) POT2.1(GND) POT2.7(L0) POT2.9(L1) SJ1.1 SJ2.1 SJ3.1 SJ4.1 SJ5.1 SJ6.1 U$1.P$1(REF) ; also sheet 1,2,3,4,5,7,11
N$19: C7.2 C8.1
N$21: POT1.2(A2) SJ1.2
N$24: POT1.3(A1) SJ2.2
N$27: POT1.5(A0) SJ3.2
N$30: R21.1
N$38: C12.2 C21.1
N$39: POT2.2(A2) SJ4.2
N$42: POT2.3(A1) SJ5.2
N$45: POT2.5(A0) SJ6.2
POT_A1_IN: POT1.8(H0) POT2.8(H0) R19.1
POT_B1_IN: POT1.10(H1) R20.1
POT_B1_IN1: POT2.10(H1) R22.1
UNBALANCED_OUT: R19.2 R20.2 R21.2 R22.2 U$1.P$5(SENS) U$1.P$6(OUT)
Unconnected: POT1.12(~CE) POT2.12(~CE)

### Notes on the sheet
- DECODER

## Sheet 7 of 11
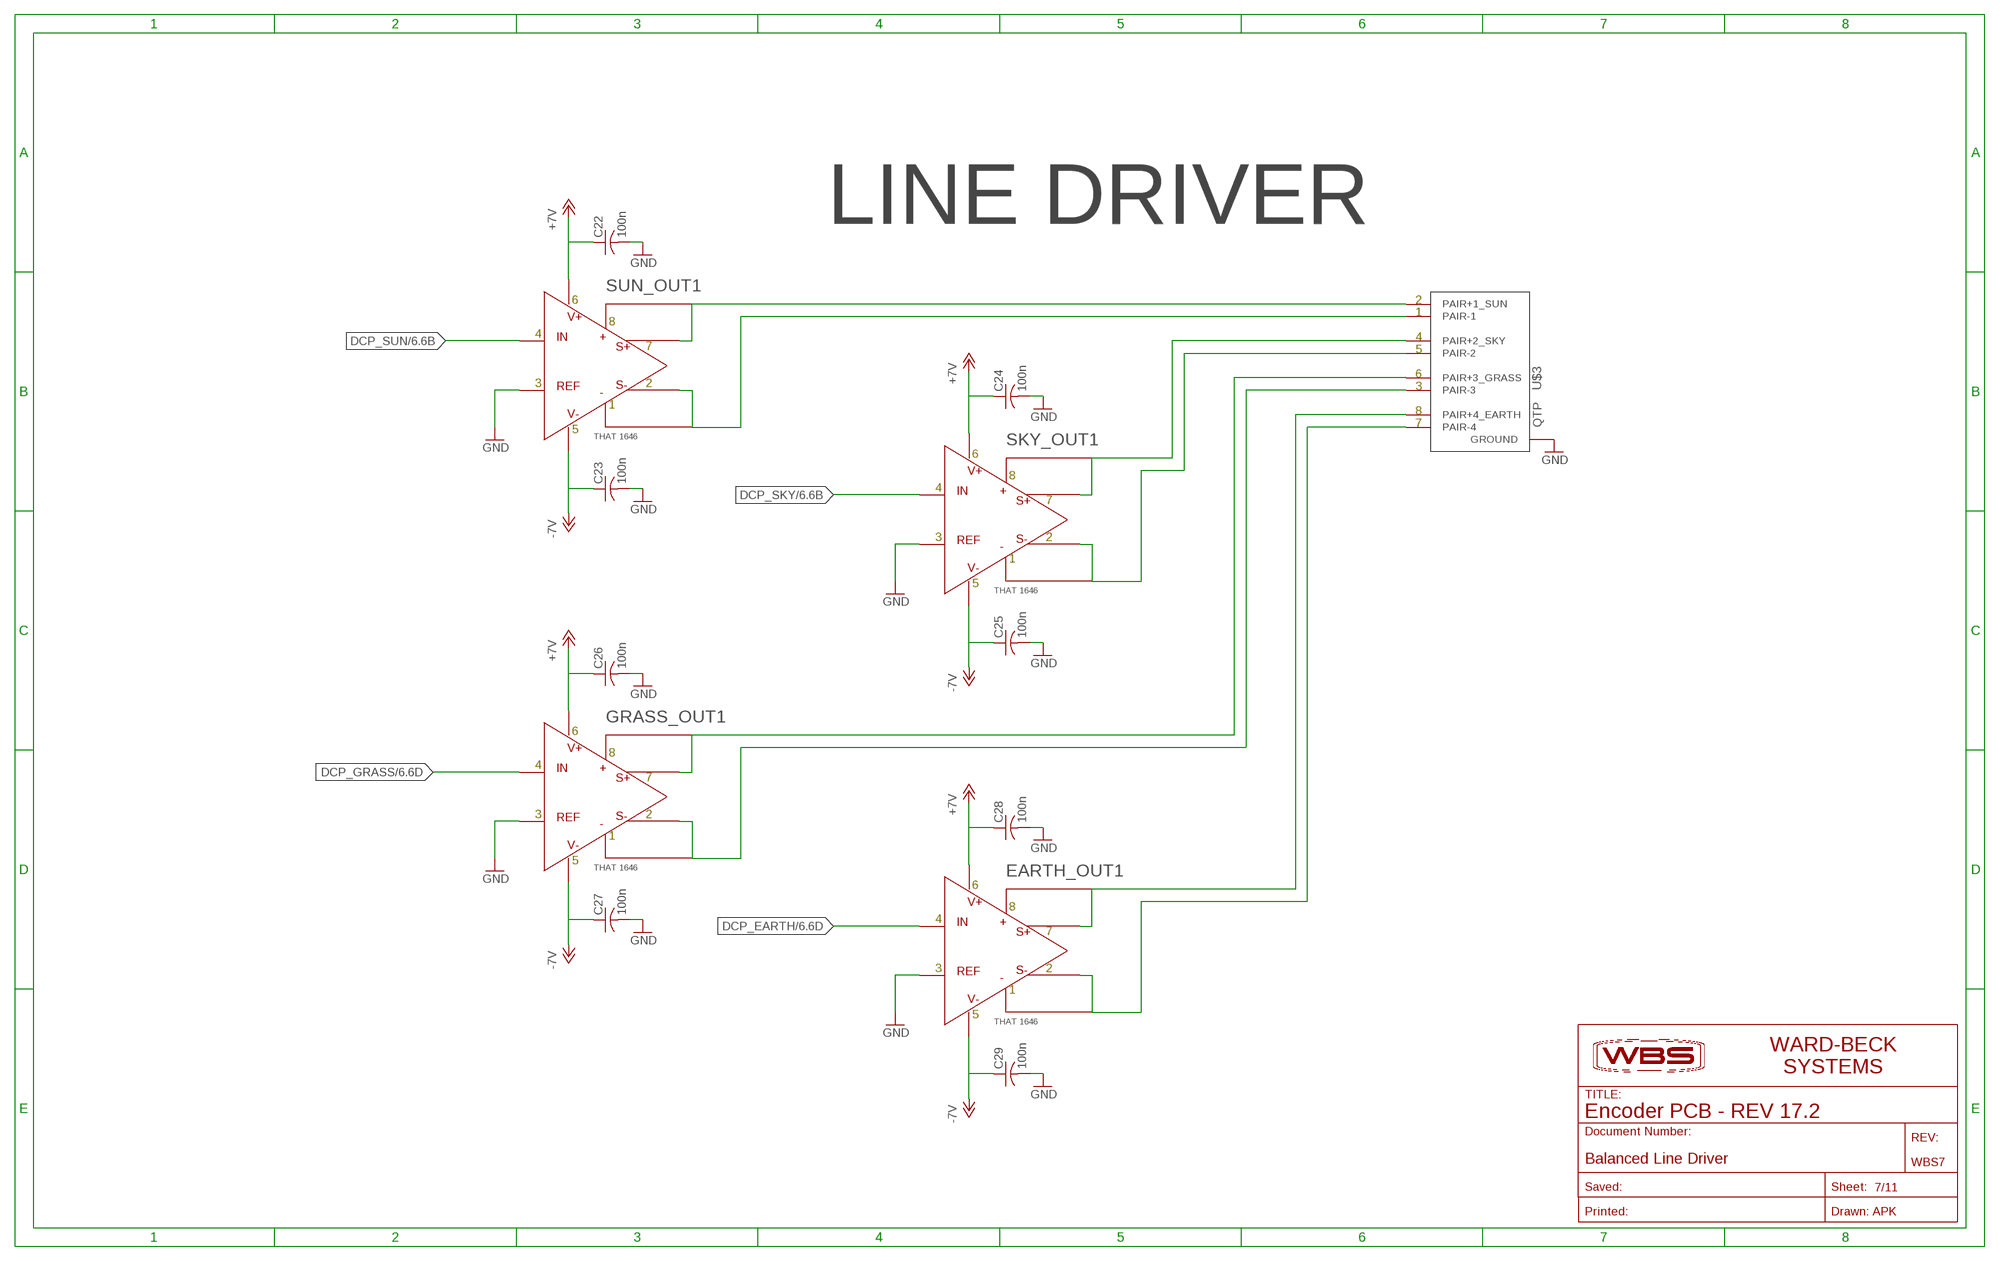
[diagram p6: schematic, sheet 7]

### Parts
C22  100n  C-USC0805  [C0805]
C23  100n  C-USC0805  [C0805]
C24  100n  C-USC0805  [C0805]
C25  100n  C-USC0805  [C0805]
C26  100n  C-USC0805  [C0805]
C27  100n  C-USC0805  [C0805]
C28  100n  C-USC0805  [C0805]
C29  100n  C-USC0805  [C0805]
EARTH_OUT1  OPAMP-THAT1646_LINE_DRIVER  [DIP8]
GRASS_OUT1  OPAMP-THAT1646_LINE_DRIVER  [DIP8]
SKY_OUT1  OPAMP-THAT1646_LINE_DRIVER  [DIP8]
SUN_OUT1  OPAMP-THAT1646_LINE_DRIVER  [DIP8]
U$3  CON-QTP  [ASSMAN-RJ45]
WBS7  Balanced Line Driver  WBS-DOCUMENT_INFO_FRAME  [WBS-FRAME_PCB]

### Nets
+12V: C22.1 C24.1 C26.1 C28.1 EARTH_OUT1.P$6(V+) GRASS_OUT1.P$6(V+) SKY_OUT1.P$6(V+) SUN_OUT1.P$6(V+) ; supply symbol labelled +7V ; also sheet 6
-12V: C23.1 C25.1 C27.1 C29.1 EARTH_OUT1.P$5(V-) GRASS_OUT1.P$5(V-) SKY_OUT1.P$5(V-) SUN_OUT1.P$5(V-) ; supply symbol labelled -7V ; also sheet 6
DCP_EARTH: EARTH_OUT1.P$4(IN) ; also sheet 6
DCP_GRASS: GRASS_OUT1.P$4(IN) ; also sheet 6
DCP_SKY: SKY_OUT1.P$4(IN) ; also sheet 6
DCP_SUN: SUN_OUT1.P$4(IN) ; also sheet 6
GND: C22.2 C23.2 C24.2 C25.2 C26.2 C27.2 C28.2 C29.2 EARTH_OUT1.P$3(REF) GRASS_OUT1.P$3(REF) SKY_OUT1.P$3(REF) SUN_OUT1.P$3(REF) U$3.P$9(GROUND) U$3.P$10(GROUND) U$3.P$11(GROUND) U$3.P$12(GROUND) ; also sheet 1,2,3,4,5,6,11
N$34: SUN_OUT1.P$7(S+) SUN_OUT1.P$8(OUT+) U$3.P1+(PAIR+1_SUN)
N$37: SUN_OUT1.P$1(OUT-) SUN_OUT1.P$2(S-) U$3.P1-(PAIR-1)
N$41: SKY_OUT1.P$7(S+) SKY_OUT1.P$8(OUT+) U$3.P2+(PAIR+2_SKY)
N$44: SKY_OUT1.P$1(OUT-) SKY_OUT1.P$2(S-) U$3.P2-(PAIR-2)
N$46: EARTH_OUT1.P$1(OUT-) EARTH_OUT1.P$2(S-) U$3.P4-(PAIR-4)
N$47: GRASS_OUT1.P$7(S+) GRASS_OUT1.P$8(OUT+) U$3.P3+(PAIR+3_GRASS)
N$48: GRASS_OUT1.P$1(OUT-) GRASS_OUT1.P$2(S-) U$3.P3-(PAIR-3)
N$49: EARTH_OUT1.P$7(S+) EARTH_OUT1.P$8(OUT+) U$3.P4+(PAIR+4_EARTH)

### Notes on the sheet
- LINE DRIVER

## Sheet 8 of 11
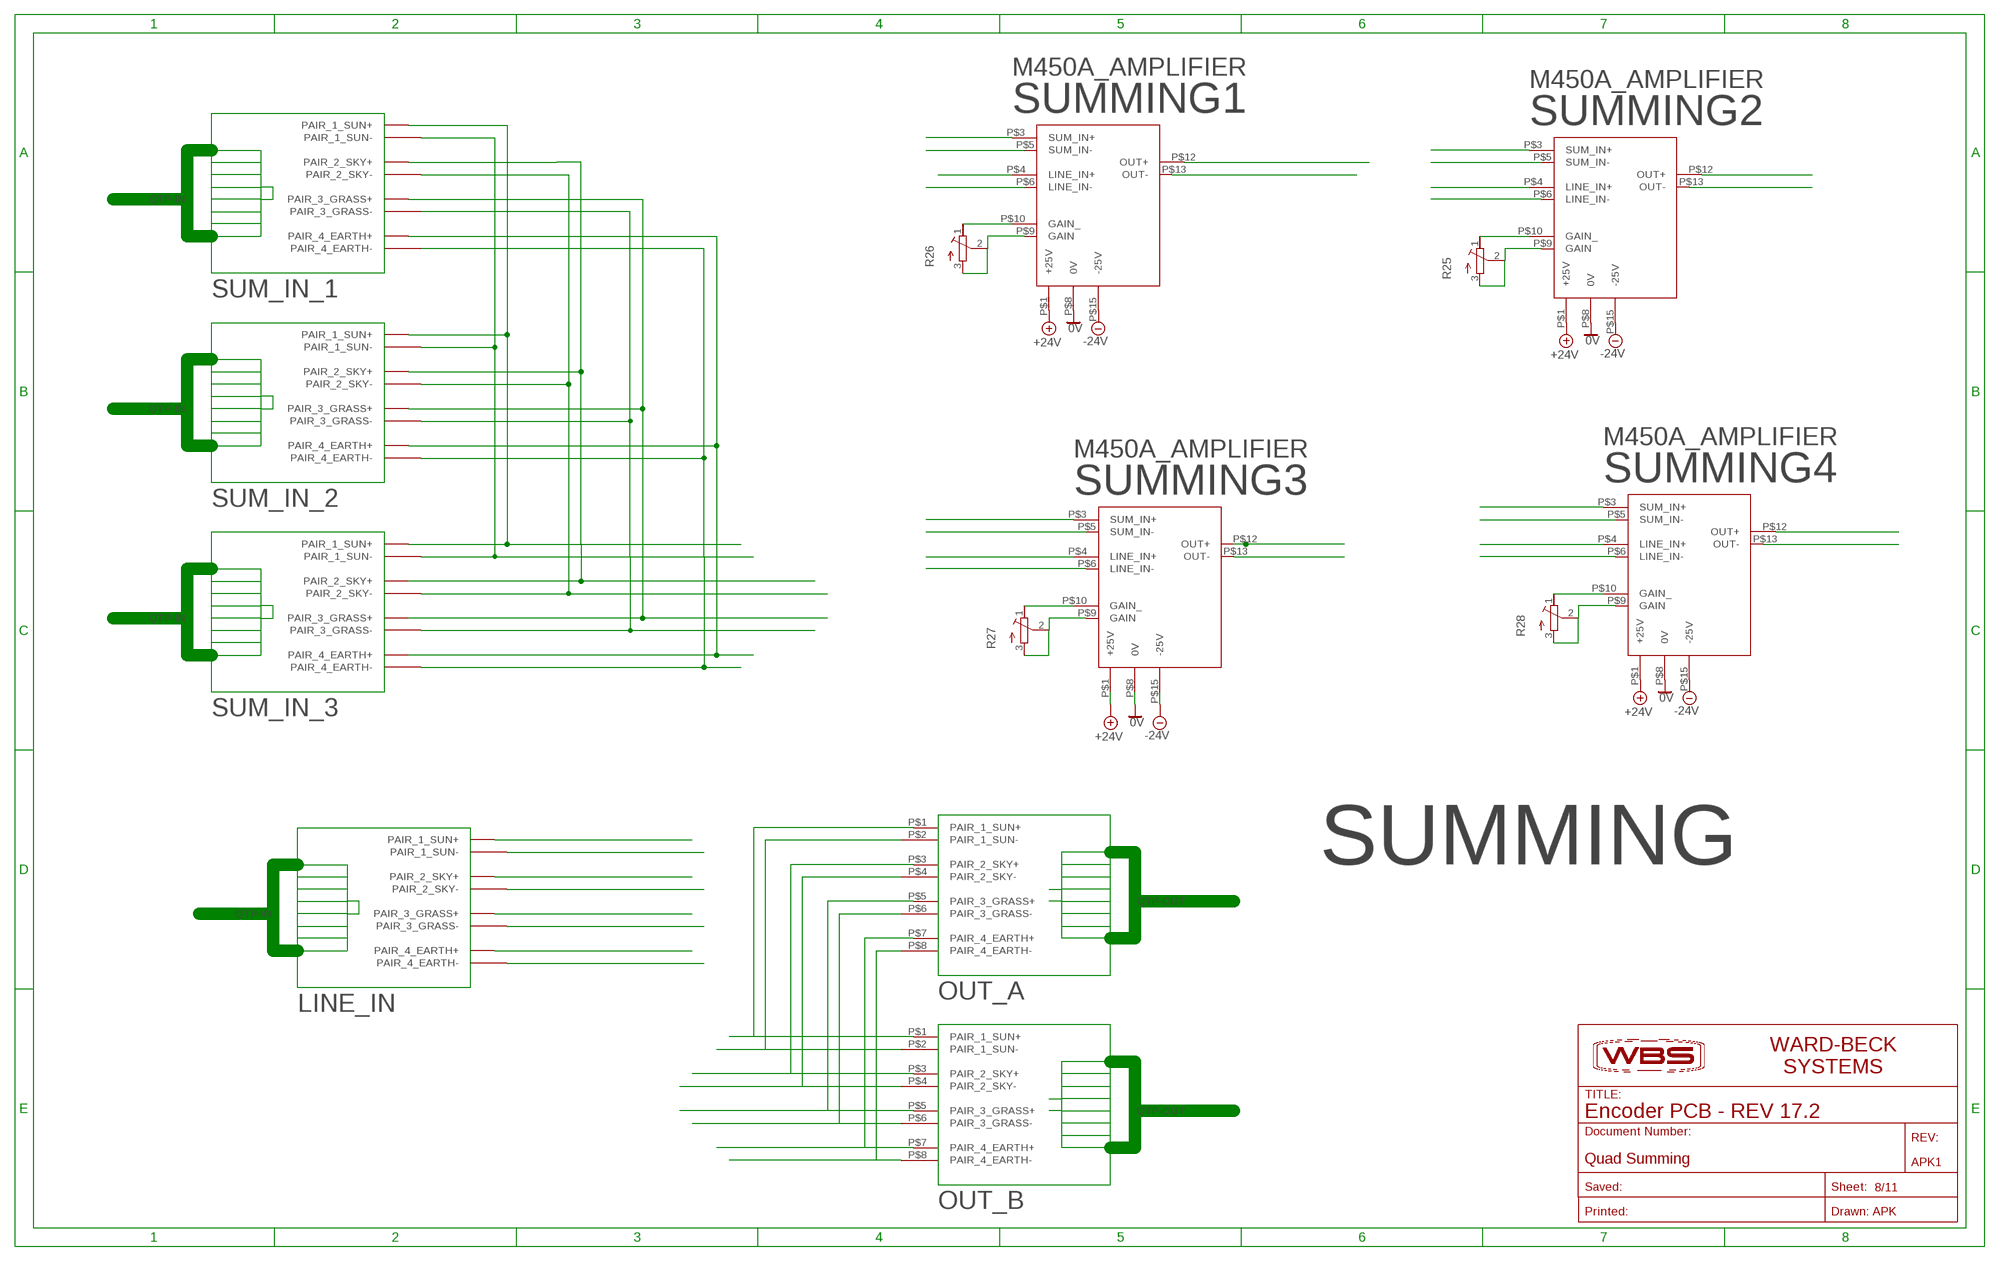
[diagram p7: schematic, sheet 8]

### Parts
APK1  Quad Summing  WBS-DOCUMENT_INFO_FRAME  [WBS-FRAME_PCB]
LINE_IN  QTP-OUT  [PLACEHOLDER]
OUT_A  QTP-IN  [PLACEHOLDER]
OUT_B  QTP-IN  [PLACEHOLDER]
R25  R-TRIMM43P  [RTRIM43P]
R26  R-TRIMM43P  [RTRIM43P]
R27  R-TRIMM43P  [RTRIM43P]
R28  R-TRIMM43P  [RTRIM43P]
SUM_IN_1  QTP-OUT  [PLACEHOLDER]
SUM_IN_2  QTP-OUT  [PLACEHOLDER]
SUM_IN_3  QTP-OUT  [PLACEHOLDER]
SUMMING1  M450A_AMPLIFIER  [M450A_AMPLIFIER]
SUMMING2  M450A_AMPLIFIER  [M450A_AMPLIFIER]
SUMMING3  M450A_AMPLIFIER  [M450A_AMPLIFIER]
SUMMING4  M450A_AMPLIFIER  [M450A_AMPLIFIER]

### Nets
0V: SUMMING1.P$8(0V) SUMMING2.P$8(0V) SUMMING3.P$8(0V) SUMMING4.P$8(0V)
+24V: SUMMING1.P$1(+25V) SUMMING2.P$1(+25V) SUMMING3.P$1(+25V) SUMMING4.P$1(+25V)
-24V: SUMMING1.P$15(-25V) SUMMING2.P$15(-25V) SUMMING3.P$15(-25V) SUMMING4.P$15(-25V)
N$59: SUM_IN_1.P$1(PAIR_1_SUN+) SUM_IN_1.P$5(PAIR_3_GRASS+) SUM_IN_1.P$7(PAIR_4_EARTH+) SUM_IN_2.P$1(PAIR_1_SUN+) SUM_IN_2.P$3(PAIR_2_SKY+) SUM_IN_2.P$5(PAIR_3_GRASS+) SUM_IN_2.P$7(PAIR_4_EARTH+) SUM_IN_3.P$1(PAIR_1_SUN+) SUM_IN_3.P$3(PAIR_2_SKY+) SUM_IN_3.P$5(PAIR_3_GRASS+) SUM_IN_3.P$7(PAIR_4_EARTH+)
N$60: SUMMING1.P$12(OUT+)
N$61: SUMMING4.P$3(SUM_IN+)
N$62: SUMMING4.P$5(SUM_IN-)
N$63: SUMMING1.P$13(OUT-)
N$64: SUMMING2.P$12(OUT+)
N$65: SUM_IN_1.P$2(PAIR_1_SUN-) SUM_IN_1.P$6(PAIR_3_GRASS-) SUM_IN_1.P$8(PAIR_4_EARTH-) SUM_IN_2.P$2(PAIR_1_SUN-) SUM_IN_2.P$6(PAIR_3_GRASS-) SUM_IN_2.P$8(PAIR_4_EARTH-) SUM_IN_3.P$2(PAIR_1_SUN-) SUM_IN_3.P$4(PAIR_2_SKY-) SUM_IN_3.P$6(PAIR_3_GRASS-) SUM_IN_3.P$8(PAIR_4_EARTH-)
N$66: SUMMING1.P$4(LINE_IN+)
N$67: SUMMING1.P$6(LINE_IN-)
N$68: SUMMING2.P$4(LINE_IN+)
N$69: SUMMING2.P$6(LINE_IN-)
N$70: SUMMING3.P$4(LINE_IN+)
N$71: SUMMING3.P$6(LINE_IN-)
N$72: SUMMING4.P$4(LINE_IN+)
N$73: SUMMING4.P$6(LINE_IN-)
N$74: SUMMING2.P$13(OUT-)
N$75: SUM_IN_1.P$3(PAIR_2_SKY+)
N$76: SUM_IN_1.P$4(PAIR_2_SKY-) SUM_IN_2.P$4(PAIR_2_SKY-)
N$77: OUT_A.P$8(PAIR_4_EARTH-) OUT_B.P$8(PAIR_4_EARTH-)
N$78: OUT_A.P$4(PAIR_2_SKY-) OUT_B.P$4(PAIR_2_SKY-)
N$79: OUT_A.P$2(PAIR_1_SUN-) OUT_B.P$2(PAIR_1_SUN-)
N$80: OUT_A.P$1(PAIR_1_SUN+) OUT_B.P$1(PAIR_1_SUN+)
N$81: OUT_A.P$3(PAIR_2_SKY+) OUT_B.P$3(PAIR_2_SKY+)
N$82: OUT_A.P$5(PAIR_3_GRASS+) OUT_B.P$5(PAIR_3_GRASS+)
N$83: OUT_A.P$7(PAIR_4_EARTH+) OUT_B.P$7(PAIR_4_EARTH+)
N$84: OUT_A.P$6(PAIR_3_GRASS-) OUT_B.P$6(PAIR_3_GRASS-)
N$85: R25.1(E) SUMMING2.P$10(GAIN_)
N$86: R25.2(S) R25.3(A) SUMMING2.P$9(GAIN)
N$87: R26.1(E) SUMMING1.P$10(GAIN_)
N$88: R26.2(S) R26.3(A) SUMMING1.P$9(GAIN)
N$89: R27.1(E) SUMMING3.P$10(GAIN_)
N$90: R27.2(S) R27.3(A) SUMMING3.P$9(GAIN)
N$91: R28.1(E) SUMMING4.P$10(GAIN_)
N$92: R28.2(S) R28.3(A) SUMMING4.P$9(GAIN)
N$93: SUMMING1.P$5(SUM_IN-)
N$94: SUMMING1.P$3(SUM_IN+)
N$95: SUMMING2.P$5(SUM_IN-)
N$96: SUMMING2.P$3(SUM_IN+)
N$97: SUMMING3.P$3(SUM_IN+)
N$98: SUMMING3.P$5(SUM_IN-)
N$99: SUMMING3.P$12(OUT+)
N$100: SUMMING3.P$13(OUT-)
N$101: SUMMING4.P$12(OUT+)
N$111: SUMMING4.P$13(OUT-)
N$112: LINE_IN.P$1(PAIR_1_SUN+) LINE_IN.P$3(PAIR_2_SKY+) LINE_IN.P$4(PAIR_2_SKY-) LINE_IN.P$5(PAIR_3_GRASS+) LINE_IN.P$6(PAIR_3_GRASS-) LINE_IN.P$7(PAIR_4_EARTH+) LINE_IN.P$8(PAIR_4_EARTH-)
N$113: LINE_IN.P$2(PAIR_1_SUN-)
Unconnected: LINE_IN.P$9(QTP-IN) OUT_A.P$9(QTP-OUT) OUT_B.P$9(QTP-OUT) SUM_IN_1.P$9(QTP-IN) SUM_IN_2.P$9(QTP-IN) SUM_IN_3.P$9(QTP-IN)

### Notes on the sheet
- SUMMING

## Sheet 9 of 11
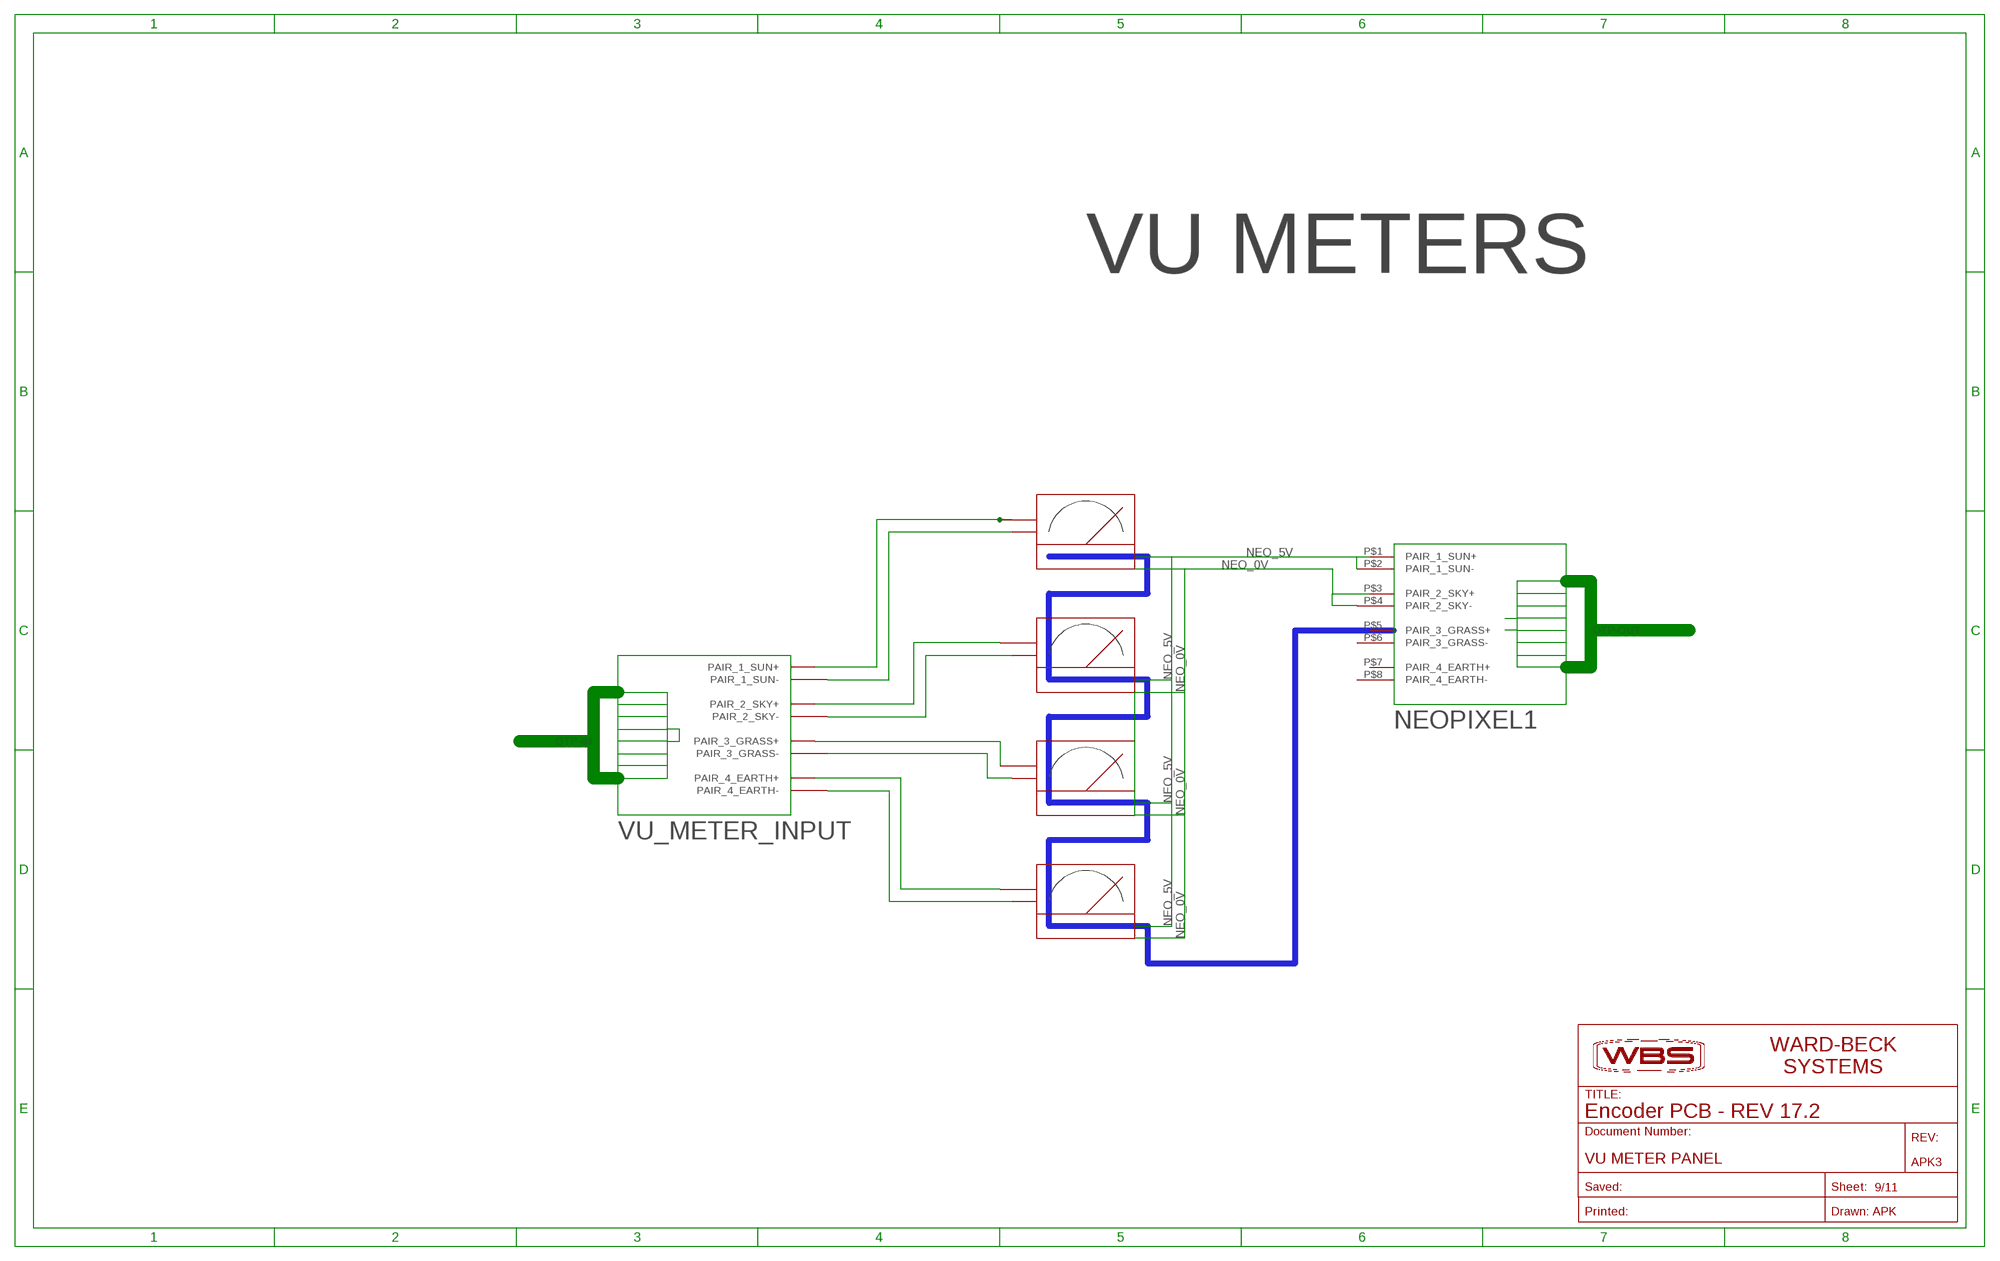
[diagram p8: schematic, sheet 9]

### Parts
APK3  VU METER PANEL  WBS-DOCUMENT_INFO_FRAME  [WBS-FRAME_PCB]
NEOPIXEL1  QTP-IN  [PLACEHOLDER]
U$7  VU_METER  [VU_METER]
U$8  VU_METER  [VU_METER]
U$9  VU_METER  [VU_METER]
U$10  VU_METER  [VU_METER]
VU_METER_INPUT  QTP-OUT  [PLACEHOLDER]

### Nets
N$103: U$7.P$2 VU_METER_INPUT.P$1(PAIR_1_SUN+)
N$104: U$7.P$1 VU_METER_INPUT.P$2(PAIR_1_SUN-)
N$105: U$8.P$2 VU_METER_INPUT.P$3(PAIR_2_SKY+)
N$106: U$8.P$1 VU_METER_INPUT.P$4(PAIR_2_SKY-)
N$107: U$10.P$1 VU_METER_INPUT.P$8(PAIR_4_EARTH-)
N$108: U$10.P$2 VU_METER_INPUT.P$7(PAIR_4_EARTH+)
N$109: U$9.P$2 VU_METER_INPUT.P$5(PAIR_3_GRASS+)
N$110: U$9.P$1 VU_METER_INPUT.P$6(PAIR_3_GRASS-)
NEO_0V: NEOPIXEL1.P$3(PAIR_2_SKY+) NEOPIXEL1.P$4(PAIR_2_SKY-)
NEO_5V: NEOPIXEL1.P$1(PAIR_1_SUN+) NEOPIXEL1.P$2(PAIR_1_SUN-)
Unconnected: NEOPIXEL1.P$5(PAIR_3_GRASS+) NEOPIXEL1.P$6(PAIR_3_GRASS-) NEOPIXEL1.P$7(PAIR_4_EARTH+) NEOPIXEL1.P$8(PAIR_4_EARTH-) NEOPIXEL1.P$9(QTP-OUT) VU_METER_INPUT.P$9(QTP-IN)

### Notes on the sheet
- VU METERS

## Sheet 10 of 11
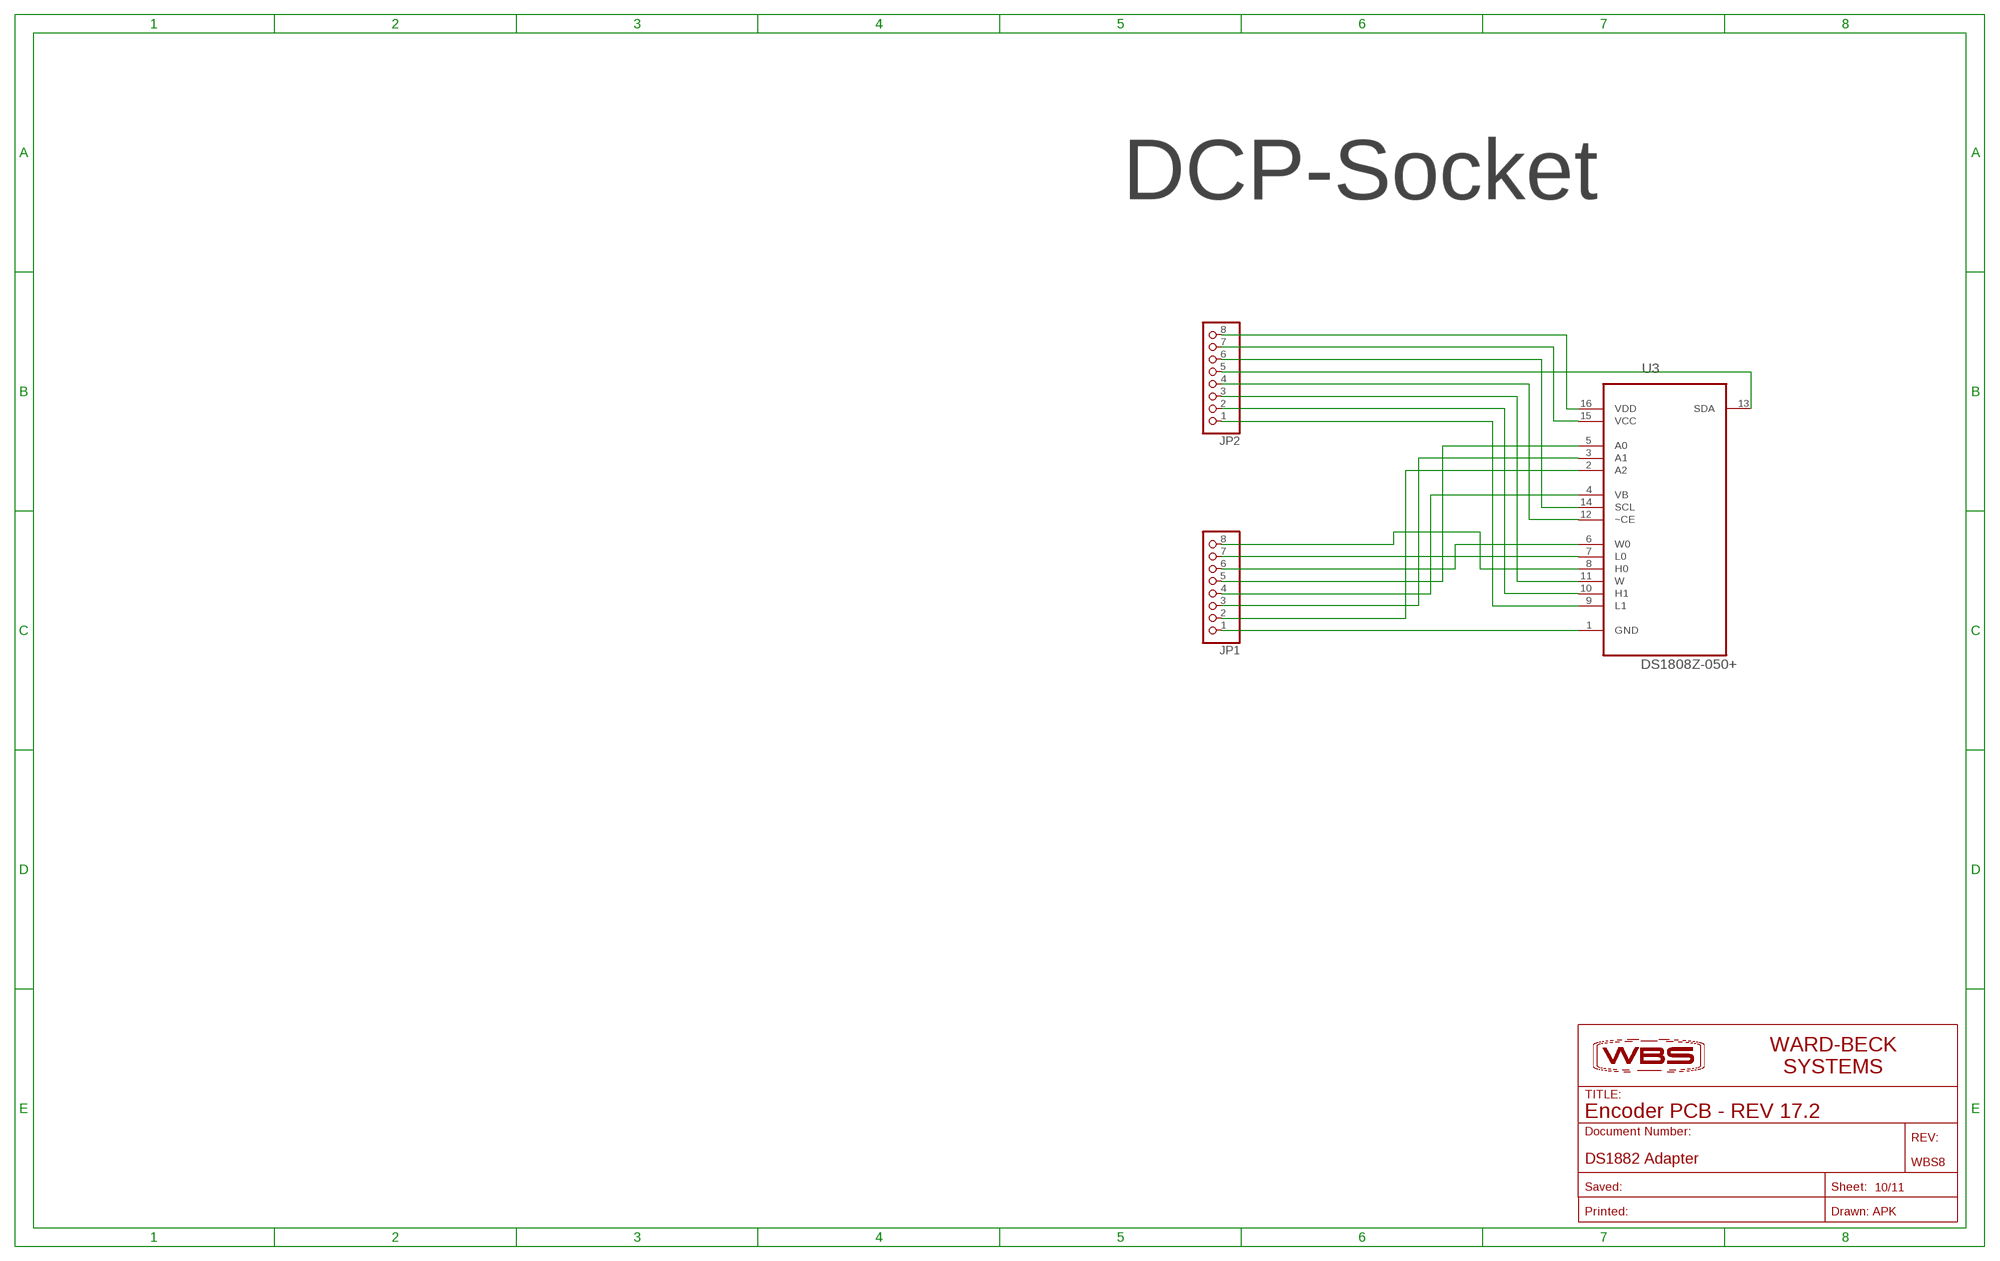
[diagram p9: schematic, sheet 10]

### Parts
JP1  PINHD-1X8  [1X08]
JP2  PINHD-1X8  [1X08]
U3  DS1808Z-050+  [SOIC127P600X175-16N]
WBS8  DS1882 Adapter  WBS-DOCUMENT_INFO_FRAME  [WBS-FRAME_PCB]

### Nets
N$28: JP1.1 U3.1(GND)
N$29: JP1.2 U3.2(A2)
N$31: JP1.3 U3.3(A1)
N$32: JP1.4 U3.4(VB)
N$33: JP1.5 U3.5(A0)
N$35: JP1.6 U3.6(W0)
N$36: JP1.7 U3.7(L0)
N$43: JP1.8 U3.8(H0)
N$50: JP2.1 U3.9(L1)
N$51: JP2.2 U3.10(H1)
N$52: JP2.3 U3.11(W)
N$53: JP2.4 U3.12(~CE)
N$54: JP2.5 U3.13(SDA)
N$55: JP2.6 U3.14(SCL)
N$56: JP2.7 U3.15(VCC)
N$57: JP2.8 U3.16(VDD)

### Notes on the sheet
- DCP-Socket

## Sheet 11 of 11
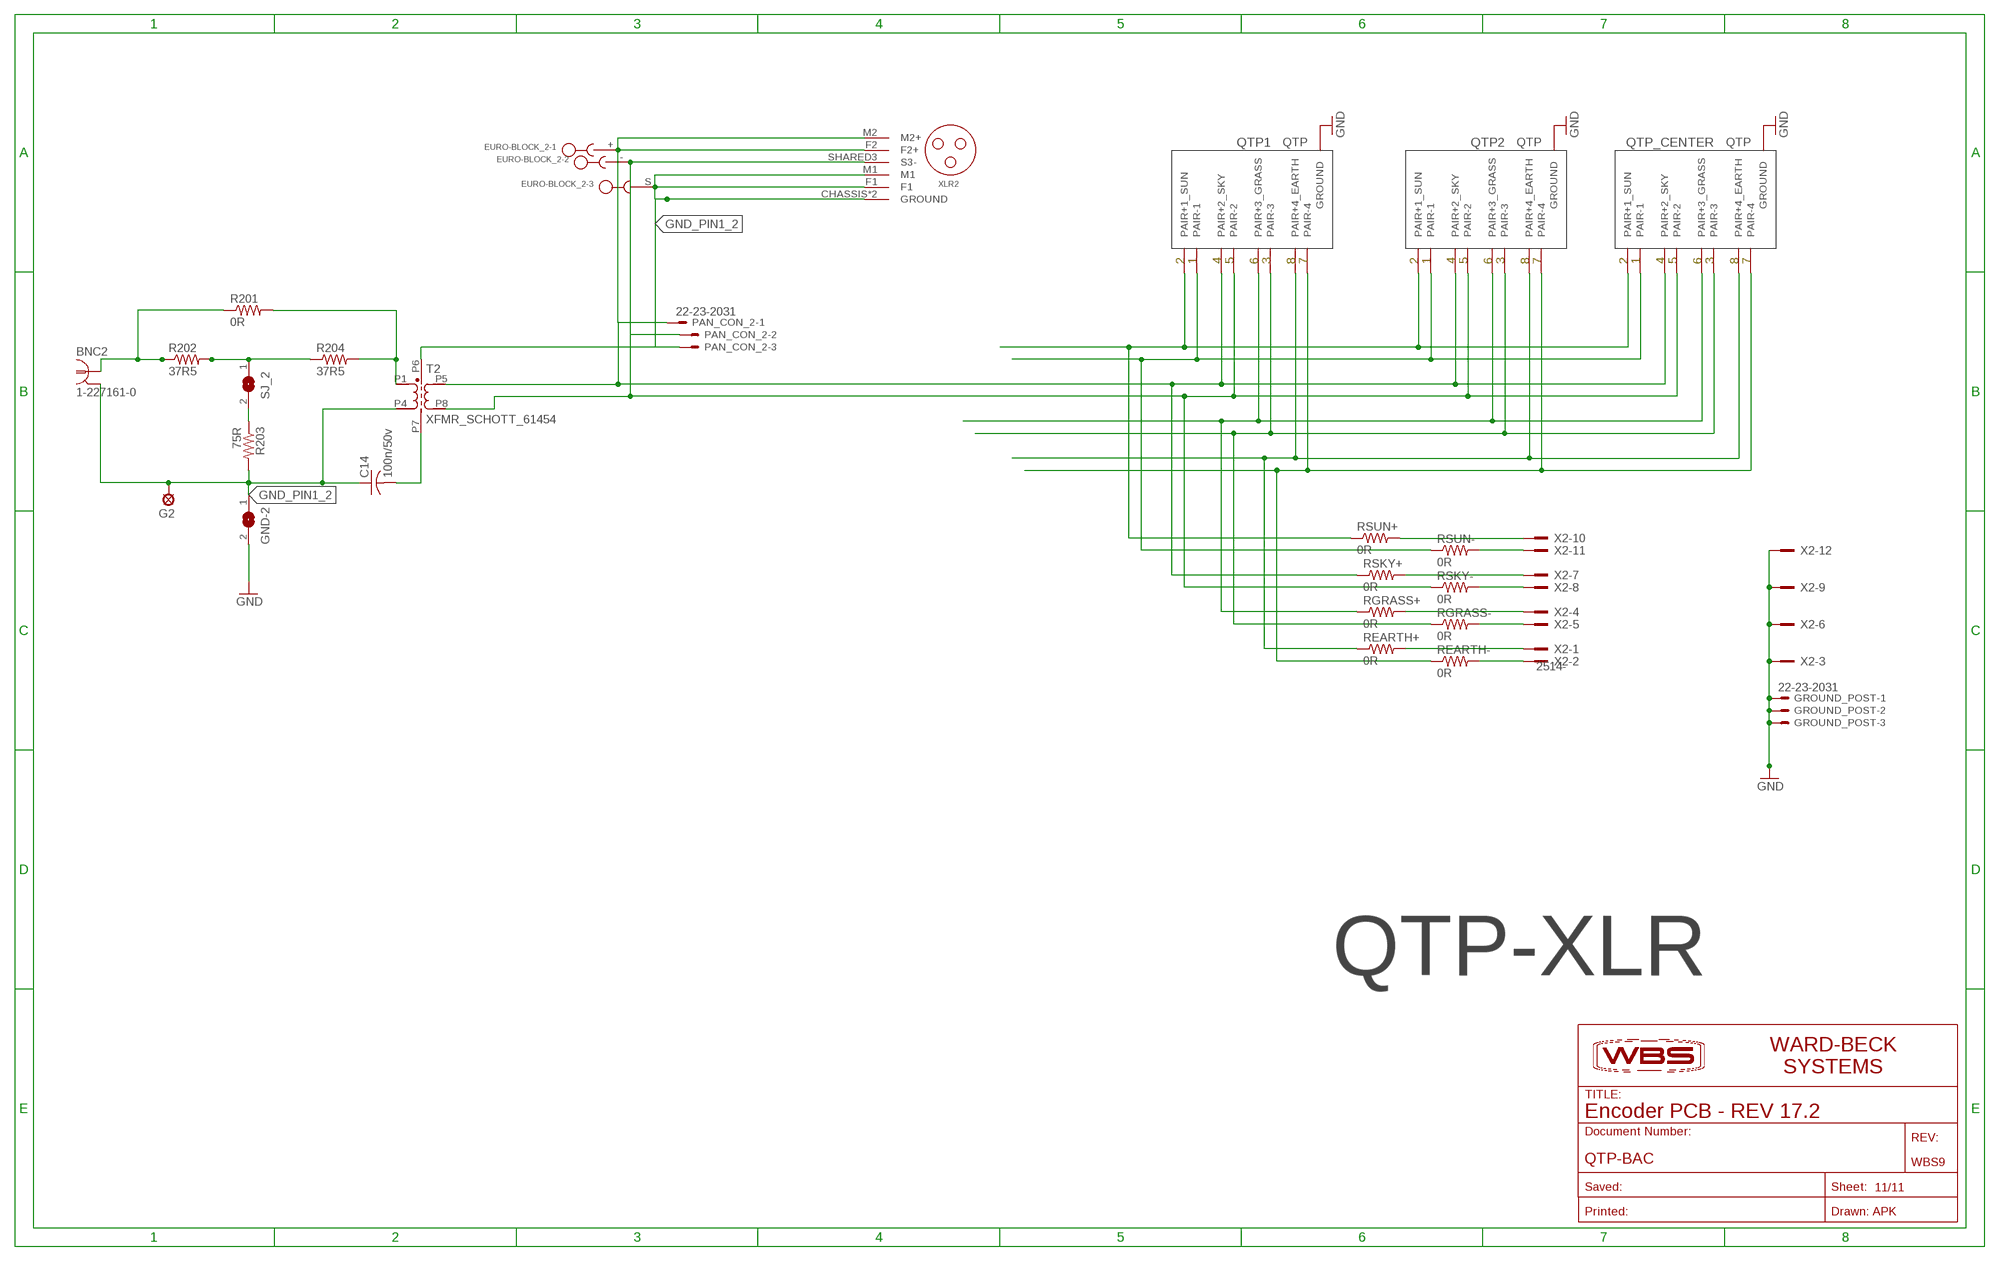
[diagram p10: schematic, sheet 11]

### Parts
BNC2  1-227161-0  [AMP_227161]
C14  100n/50v  C-USC0805  [C0805]
EURO-BLOCK_2  CON-PHOENIX_RIGHT_ANGLE_3.81  [CON-PHOENIX_MC1.5/3-G-3.81]
G2  LSP10  [LSP10]
GND-2  SJ  [SJ]
GROUND_POST  22-23-2031  [22-23-2031]
PAN_CON_2  22-23-2031  [22-23-2031]
QTP1  CON-QTP  [ASSMAN-RJ45]
QTP2  CON-QTP  [ASSMAN-RJ45]
QTP_CENTER  CON-QTP  [ASSMAN-RJ45]
R201  0R  R-US_R0805W  [R0805W]
R202  37R5  R-US_R0805W  [R0805W]
R203  75R  R-US_R0805W  [R0805W]
R204  37R5  R-US_R0805W  [R0805W]
REARTH+  0R  R-US_R0805W  [R0805W]
REARTH-  0R  R-US_R0805W  [R0805W]
RGRASS+  0R  R-US_R0805W  [R0805W]
RGRASS-  0R  R-US_R0805W  [R0805W]
RSKY+  0R  R-US_R0805W  [R0805W]
RSKY-  0R  R-US_R0805W  [R0805W]
RSUN+  0R  R-US_R0805W  [R0805W]
RSUN-  0R  R-US_R0805W  [R0805W]
SJ_2  SJ  [SJ]
T2  XFMR_SCHOTT_61454  [SCHOTT_61454]
WBS9  QTP-BAC  WBS-DOCUMENT_INFO_FRAME  [WBS-FRAME_PCB]
X2  2514-  [PAK100/2500-14]
XLR2  CON-XLR-NEUTRIK_A_BISEXUAL  [CON_NEUTRIK_A_BISEXUAL_H]

### Nets
CH1+1 [Pair 1]: QTP1.P1+(PAIR+1_SUN) QTP2.P1+(PAIR+1_SUN) QTP_CENTER.P1+(PAIR+1_SUN) RSUN+.1
CH1-1 [Pair 1]: QTP1.P1-(PAIR-1) QTP2.P1-(PAIR-1) QTP_CENTER.P1-(PAIR-1) RSUN-.1
CH2+1 [Pair 2]: EURO-BLOCK_2.+ PAN_CON_2.1 QTP1.P2+(PAIR+2_SKY) QTP2.P2+(PAIR+2_SKY) QTP_CENTER.P2+(PAIR+2_SKY) RSKY+.1 T2.P5 XLR2.F2(F2+) XLR2.M2(M2+)
CH2-1 [Pair 2]: EURO-BLOCK_2.- PAN_CON_2.2 QTP1.P2-(PAIR-2) QTP2.P2-(PAIR-2) QTP_CENTER.P2-(PAIR-2) RSKY-.1 T2.P8 XLR2.SHARED3(S3-)
CH3+1 [Pair 3]: QTP1.P3+(PAIR+3_GRASS) QTP2.P3+(PAIR+3_GRASS) QTP_CENTER.P3+(PAIR+3_GRASS) RGRASS+.1
CH3-1 [Pair 3]: QTP1.P3-(PAIR-3) QTP2.P3-(PAIR-3) QTP_CENTER.P3-(PAIR-3) RGRASS-.1
CH4+1 [Pair 4]: QTP1.P4+(PAIR+4_EARTH) QTP2.P4+(PAIR+4_EARTH) QTP_CENTER.P4+(PAIR+4_EARTH) REARTH+.1
CH4-1 [Pair 4]: QTP1.P4-(PAIR-4) QTP2.P4-(PAIR-4) QTP_CENTER.P4-(PAIR-4) REARTH-.1
GND: GND-2.2 GROUND_POST.1 GROUND_POST.2 GROUND_POST.3 QTP1.P$9(GROUND) QTP1.P$10(GROUND) QTP1.P$11(GROUND) QTP1.P$12(GROUND) QTP2.P$9(GROUND) QTP2.P$10(GROUND) QTP2.P$11(GROUND) QTP2.P$12(GROUND) QTP_CENTER.P$9(GROUND) QTP_CENTER.P$10(GROUND) QTP_CENTER.P$11(GROUND) QTP_CENTER.P$12(GROUND) X2.3 X2.6 X2.9 X2.12 ; also sheet 1,2,3,4,5,6,7
GND_PIN1_2 [Pair 4]: BNC2.2 C14.1 EURO-BLOCK_2.S G2.MP GND-2.1 PAN_CON_2.3 R203.2 T2.P4 T2.P6 XLR2.CHASSIS(GROUND) XLR2.F1 XLR2.GROUND XLR2.M1
N$116 [Pair 2]: R201.2 R204.2 T2.P1
N$117 [Pair 2]: R202.2 R204.1 SJ_2.1
N$118 [Pair 2]: BNC2.1 R201.1 R202.1
N$119 [Pair 2]: C14.2 T2.P7
N$130: R203.1 SJ_2.2
N$133 [Pair 4]: RSUN+.2 X2.10
N$134 [Pair 1]: REARTH-.2 X2.2
N$135 [Pair 1]: REARTH+.2 X2.1
N$136 [Pair 2]: RGRASS-.2 X2.5
N$137 [Pair 2]: RGRASS+.2 X2.4
N$138 [Pair 3]: RSKY-.2 X2.8
N$139 [Pair 3]: RSKY+.2 X2.7
N$140 [Pair 4]: RSUN-.2 X2.11
Unconnected: X2.13 X2.14

### Notes on the sheet
- QTP-XLR

## Library data of the parts
APK1 APK3 WBS1-WBS9 = APK - PARTS:WBS-DOCUMENT_INFO_FRAME
BNC2 = con-coax:?227161*: JACK, RIGHT ANGLE, 50 OHM, PCB, BNC Source: amp_227161.pdf; MF: TYCO ELECTRONICS; MPN: 1-227161; OC_FARNELL: unknown; OC_NEWARK: 33B3200
C1-C12 C14 C21-C29 = rcl:C-US: CAPACITOR, American symbol
EARTH_OUT1 GRASS_OUT1 SKY_OUT1 SUN_OUT1 = APK - PARTS:OPAMP-THAT1646_LINE_DRIVER
EARTH_POT1 GRASS_POT1 SKY_POT1 SUN_POT1 = APK - PARTS:WBS_10-081_DUALPOT+DUALSWITCH
EURO-BLOCK_2 = APK - PARTS:CON-PHOENIX_RIGHT_ANGLE_3.81
FADER_BUT_ON FADER_BUT_ONLY FADER_BUT_SEL FRONT_BUT_EARTH FRONT_BUT_GRASS FRONT_BUT_SEL FRONT_BUT_SKY FRONT_BUT_SUN = APK - PARTS:SWITCH-POD-BUTTON_WITH_LED
FADER_CONNECTOR SV1 = con-lstb:MA06-2: PIN HEADER; OC_FARNELL: unknown; OC_NEWARK: unknown
FADER_LIN_SLIDE = APK - PARTS:BOURNS-PTA6043_SLIDEPOT
FRONT_CON_1-FRONT_CON_3 MAIN_TO_FRONT_CON_1-MAIN_TO_FRONT_CON_3 = con-lstb:MA04-2: PIN HEADER; OC_FARNELL: unknown; OC_NEWARK: unknown
FRONT_EARTH FRONT_GRASS FRONT_SKY FRONT_SUN FRONT_SUN1 = adafruit:WS2812
G2 = solpad:LSP10: SOLDER PAD drill 1.0 mm, distributor Buerklin, 12H555
GND-2 SJ_2 = jumper:SJ: SMD solder JUMPER
GROUND_POST PAN_CON_2 = con-molex:22-23-2031: .100" (2.54mm) Center Header - 3 Pin; MF: MOLEX; MPN: 22-23-2031; OC_FARNELL: 1462950; OC_NEWARK: 30C0862
JP1 JP2 = pinhead:PINHD-1X8: PIN HEADER
LINE_IN SUM_IN_1-SUM_IN_3 VU_METER_INPUT = Ward-Beck Systems - 2015:QTP-OUT
LINK_1 R1-R24 R201-R204 R_EARTH_SW R_GRASS_SW R_SKY_SW R_SUN_SW REARTH+ REARTH- RGRASS+ RGRASS- RS1-RS11 RS13-RS17 RSKY+ RSKY- RSUN+ RSUN- = rcl:R-US_: RESISTOR, American symbol
LSP1-LSP3 = solpad:MCS10B: SOLDER PAD MC S1, distributor Buerklin, 15F505
NEOPIXEL1 OUT_A OUT_B = Ward-Beck Systems - 2015:QTP-IN
PCB1 = E14_Arduino_revB:ARDUINO_MEGA2560: Device for representing an Arduino Mega 2560 board with a footprint in an EAGLE design. Created by Dave Young for Element14. More EAGLE documentation at: http://www.element14.com/community/community/knode/cadsoft_eagle
POT1 POT2 U3 = Maxim_By_element14_Batch_1:DS1808Z-050+: Dual Log Digital Potentiometer; MPN: DS1808Z-050+; OC_FARNELL: 1379825; OC_NEWARK: 20J3546; PACKAGE: SOIC-16; SUPPLIER: MAXIM INTEGRATED PRODUCTS
QTP1 QTP2 QTP_CENTER U$3 = APK - PARTS:CON-QTP
R25-R28 = resistor:R-TRIMM: Trimm resistor
SJ1-SJ6 = jumper:SJ2W: SMD solder JUMPER
SUMMING1-SUMMING4 = Ward-Beck Systems - 2015:M450A_AMPLIFIER
T2 = APK - PARTS:XFMR_SCHOTT_61454
U1 U2 = NSC_By_element14_Batch_1.1:DS75176BN: Transceivers; MPN: DS75176BN; OC_FARNELL: 9487190; OC_NEWARK: 41K1918; PACKAGE: DIP-8; SUPPLIER: National Semiconductor
U$1 = APK - PARTS:OPAMP-THAT1246_LINE_RECEIVER
U$7-U$10 = TONY_WBS:VU_METER
X1 = con-thomas-betts:D-SUB9-: D-Subminiatur Connector Source: Electronioc Interconnects European Edition 1998; OC_FARNELL: unknown; OC_NEWARK: unknown
X2 = con-3m:2514-: 3M (TM) Pak 100 4-Wall Header Source: 3M; OC_FARNELL: unknown; OC_NEWARK: unknown
XLR2 = APK - PARTS:CON-XLR-NEUTRIK_A_BISEXUAL

## Net classes
0 default: width 0.305 mm
1 Pair 1: width 0.305 mm
2 Pair 2: width 0.305 mm
3 Pair 3: width 0.305 mm
4 Pair 4: width 0.305 mm